# Altium project STAR_Prop_Reciever.PrjPcb
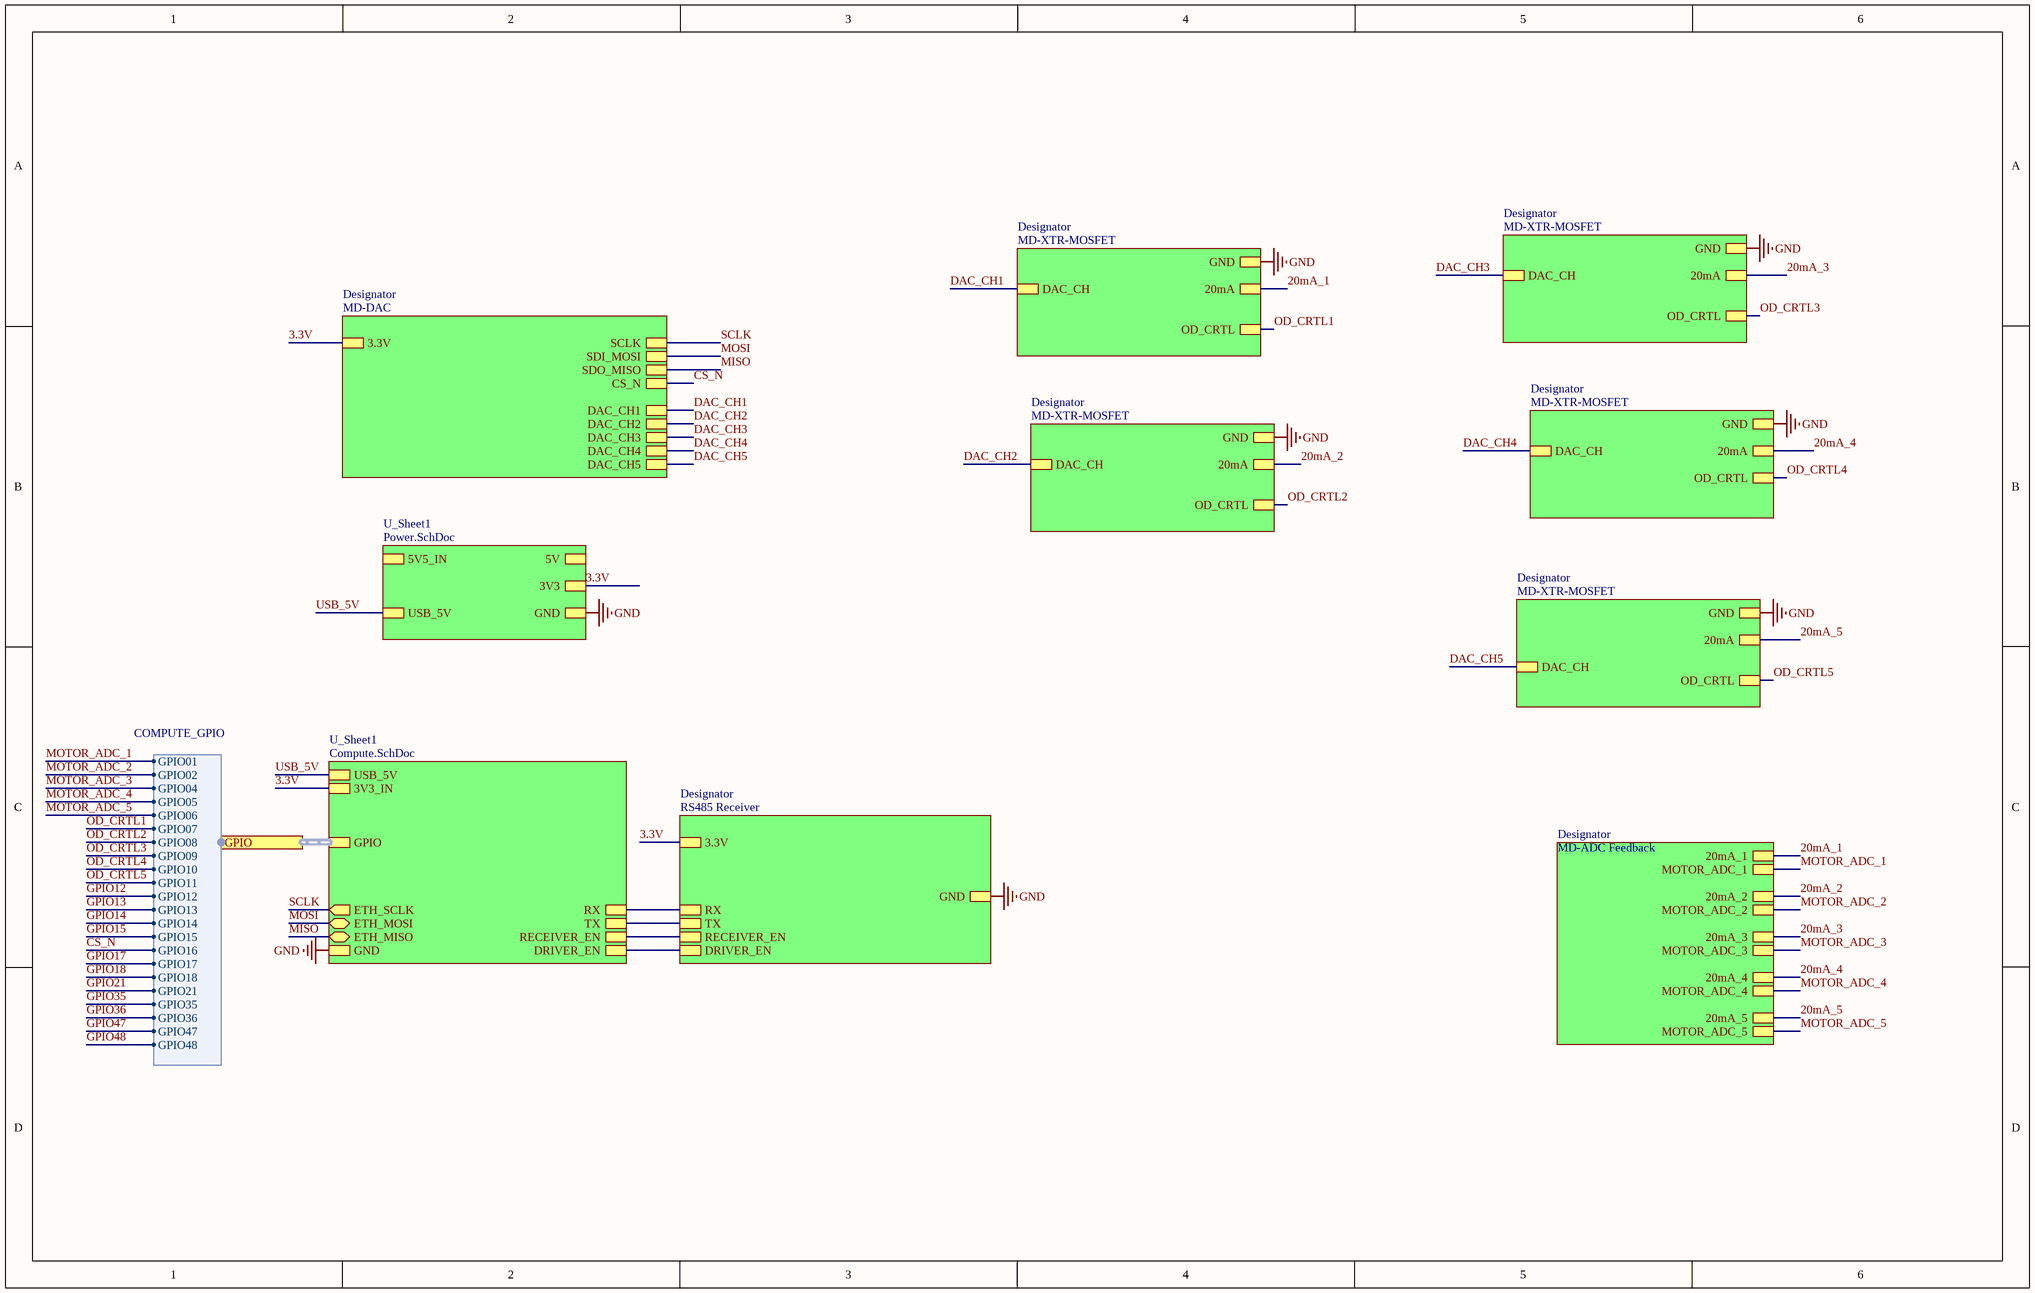
[diagram p0: Main.SchDoc]
7 sheets, 181 parts. Net scope: hierarchical (ports join the sheet entries above them; power ports are global).
Board file: PCB3.PcbDoc
Sheets:
  Main.SchDoc
    Designator = RS485 Receiver.SchDoc
    Designator = MD-DAC.SchDoc
    Designator = MD-XTR-MOSFET.SchDoc
    Designator = MD-ADC Feedback.SchDoc
    Designator = MD-XTR-MOSFET.SchDoc
    Designator = MD-XTR-MOSFET.SchDoc
    Designator = MD-XTR-MOSFET.SchDoc
    Designator = MD-XTR-MOSFET.SchDoc
    U_Sheet1 = Compute.SchDoc
    U_Sheet1 = Power.SchDoc

## Sheet Main.SchDoc
size B; SheetNumber: 1; SheetTotal: 7

### Sub-sheets
Designator = RS485 Receiver: 3.3V, GND, DRIVER_EN, RECEIVER_EN, TX, RX
Designator = MD-DAC: 3.3V, DAC_CH1, DAC_CH2, DAC_CH3, DAC_CH4, DAC_CH5, SCLK, SDI_MOSI, SDO_MISO, CS_N
Designator = MD-XTR-MOSFET: DAC_CH, OD_CRTL, GND, 20mA
Designator = MD-ADC Feedback: MOTOR_ADC_5, 20mA_5, MOTOR_ADC_4, 20mA_4, MOTOR_ADC_3, 20mA_3, MOTOR_ADC_2, 20mA_2, MOTOR_ADC_1, 20mA_1
Designator = MD-XTR-MOSFET: DAC_CH, OD_CRTL, GND, 20mA
Designator = MD-XTR-MOSFET: DAC_CH, OD_CRTL, GND, 20mA
Designator = MD-XTR-MOSFET: DAC_CH, OD_CRTL, 20mA, GND
Designator = MD-XTR-MOSFET: DAC_CH, OD_CRTL, 20mA, GND
U_Sheet1 = Compute.SchDoc: USB_5V, 3V3_IN, DRIVER_EN, RECEIVER_EN, TX, RX, GPIO (harness COMPUTE_GPIO), GND, ETH_MISO (bidir), ETH_MOSI (bidir), ETH_SCLK (out)
U_Sheet1 = Power.SchDoc: GND, 3V3, USB_5V, 5V5_IN, 5V

### Ports
GPIO (harness COMPUTE_GPIO)

### Harnesses
COMPUTE_GPIO: GPIO01, GPIO02, GPIO04, GPIO05, GPIO06, GPIO07, GPIO08, GPIO14, GPIO17, GPIO18, GPIO21, GPIO35, GPIO36, GPIO47, GPIO48, GPIO10, GPIO16, GPIO15, GPIO13, GPIO12, GPIO11, GPIO09

### Nets
3.3V: sheet Designator/3.3V, sheet Designator/3.3V, sheet U_Sheet1/3V3_IN, sheet U_Sheet1/3V3
GND: sheet Designator/GND, sheet Designator/GND, sheet Designator/GND, sheet Designator/GND, sheet Designator/GND, sheet Designator/GND, sheet U_Sheet1/GND, sheet U_Sheet1/GND
USB_5V: sheet U_Sheet1/USB_5V, sheet U_Sheet1/USB_5V
20mA_1: sheet Designator/RECEIVER_EN, sheet Designator/MOTOR_ADC_1, sheet Designator/20mA_1, sheet Designator/20mA, sheet U_Sheet1/RECEIVER_EN, port GPIO.GPIO01  [also labelled MOTOR_ADC_1]
20mA_2: sheet Designator/DRIVER_EN, sheet Designator/MOTOR_ADC_2, sheet Designator/20mA_2, sheet Designator/20mA, sheet U_Sheet1/DRIVER_EN, port GPIO.GPIO02  [also labelled MOTOR_ADC_2]
20mA_3: sheet Designator/MOTOR_ADC_3, sheet Designator/20mA_3, sheet Designator/20mA, port GPIO.GPIO04  [also labelled MOTOR_ADC_3]
20mA_4: sheet Designator/MOTOR_ADC_4, sheet Designator/20mA_4, sheet Designator/20mA, port GPIO.GPIO05  [also labelled MOTOR_ADC_4]
20mA_5: sheet Designator/20mA, sheet Designator/MOTOR_ADC_5, sheet Designator/20mA_5, port GPIO.GPIO06  [also labelled MOTOR_ADC_5]
CS_N: sheet Designator/CS_N, port GPIO.GPIO16
DAC_CH1: sheet Designator/DAC_CH1, sheet Designator/DAC_CH
DAC_CH2: sheet Designator/DAC_CH2, sheet Designator/DAC_CH
DAC_CH3: sheet Designator/DAC_CH3, sheet Designator/DAC_CH
DAC_CH4: sheet Designator/DAC_CH4, sheet Designator/DAC_CH
DAC_CH5: sheet Designator/DAC_CH5, sheet Designator/DAC_CH
GPIO12: port GPIO.GPIO12
GPIO13: port GPIO.GPIO13
GPIO14: port GPIO.GPIO14
GPIO15: port GPIO.GPIO15
GPIO17: port GPIO.GPIO17
GPIO18: port GPIO.GPIO18
GPIO21: port GPIO.GPIO21
GPIO35: port GPIO.GPIO35
GPIO36: port GPIO.GPIO36
GPIO47: port GPIO.GPIO47
GPIO48: port GPIO.GPIO48
MISO: sheet Designator/SDO_MISO, sheet U_Sheet1/ETH_MISO
MOSI: sheet Designator/SDI_MOSI, sheet U_Sheet1/ETH_MOSI
OD_CRTL1: sheet Designator/OD_CRTL, port GPIO.GPIO07  [project net GPIO07]
OD_CRTL2: sheet Designator/OD_CRTL, port GPIO.GPIO08  [project net GPIO08]
OD_CRTL3: sheet Designator/OD_CRTL, port GPIO.GPIO09  [project net GPIO09]
OD_CRTL4: sheet Designator/OD_CRTL, port GPIO.GPIO10  [project net GPIO10]
OD_CRTL5: sheet Designator/OD_CRTL, port GPIO.GPIO11  [project net GPIO11]
SCLK: sheet Designator/SCLK, sheet U_Sheet1/ETH_SCLK
NetCR1_1: sheet Designator/RX, sheet U_Sheet1/RX
NetCR1_4: sheet Designator/TX, sheet U_Sheet1/TX

### Buses and harness runs
harness port GPIO = sheet U_Sheet1/GPIO

## Sheet RS485 Receiver.SchDoc
size C; SheetNumber: 3; SheetTotal: 7
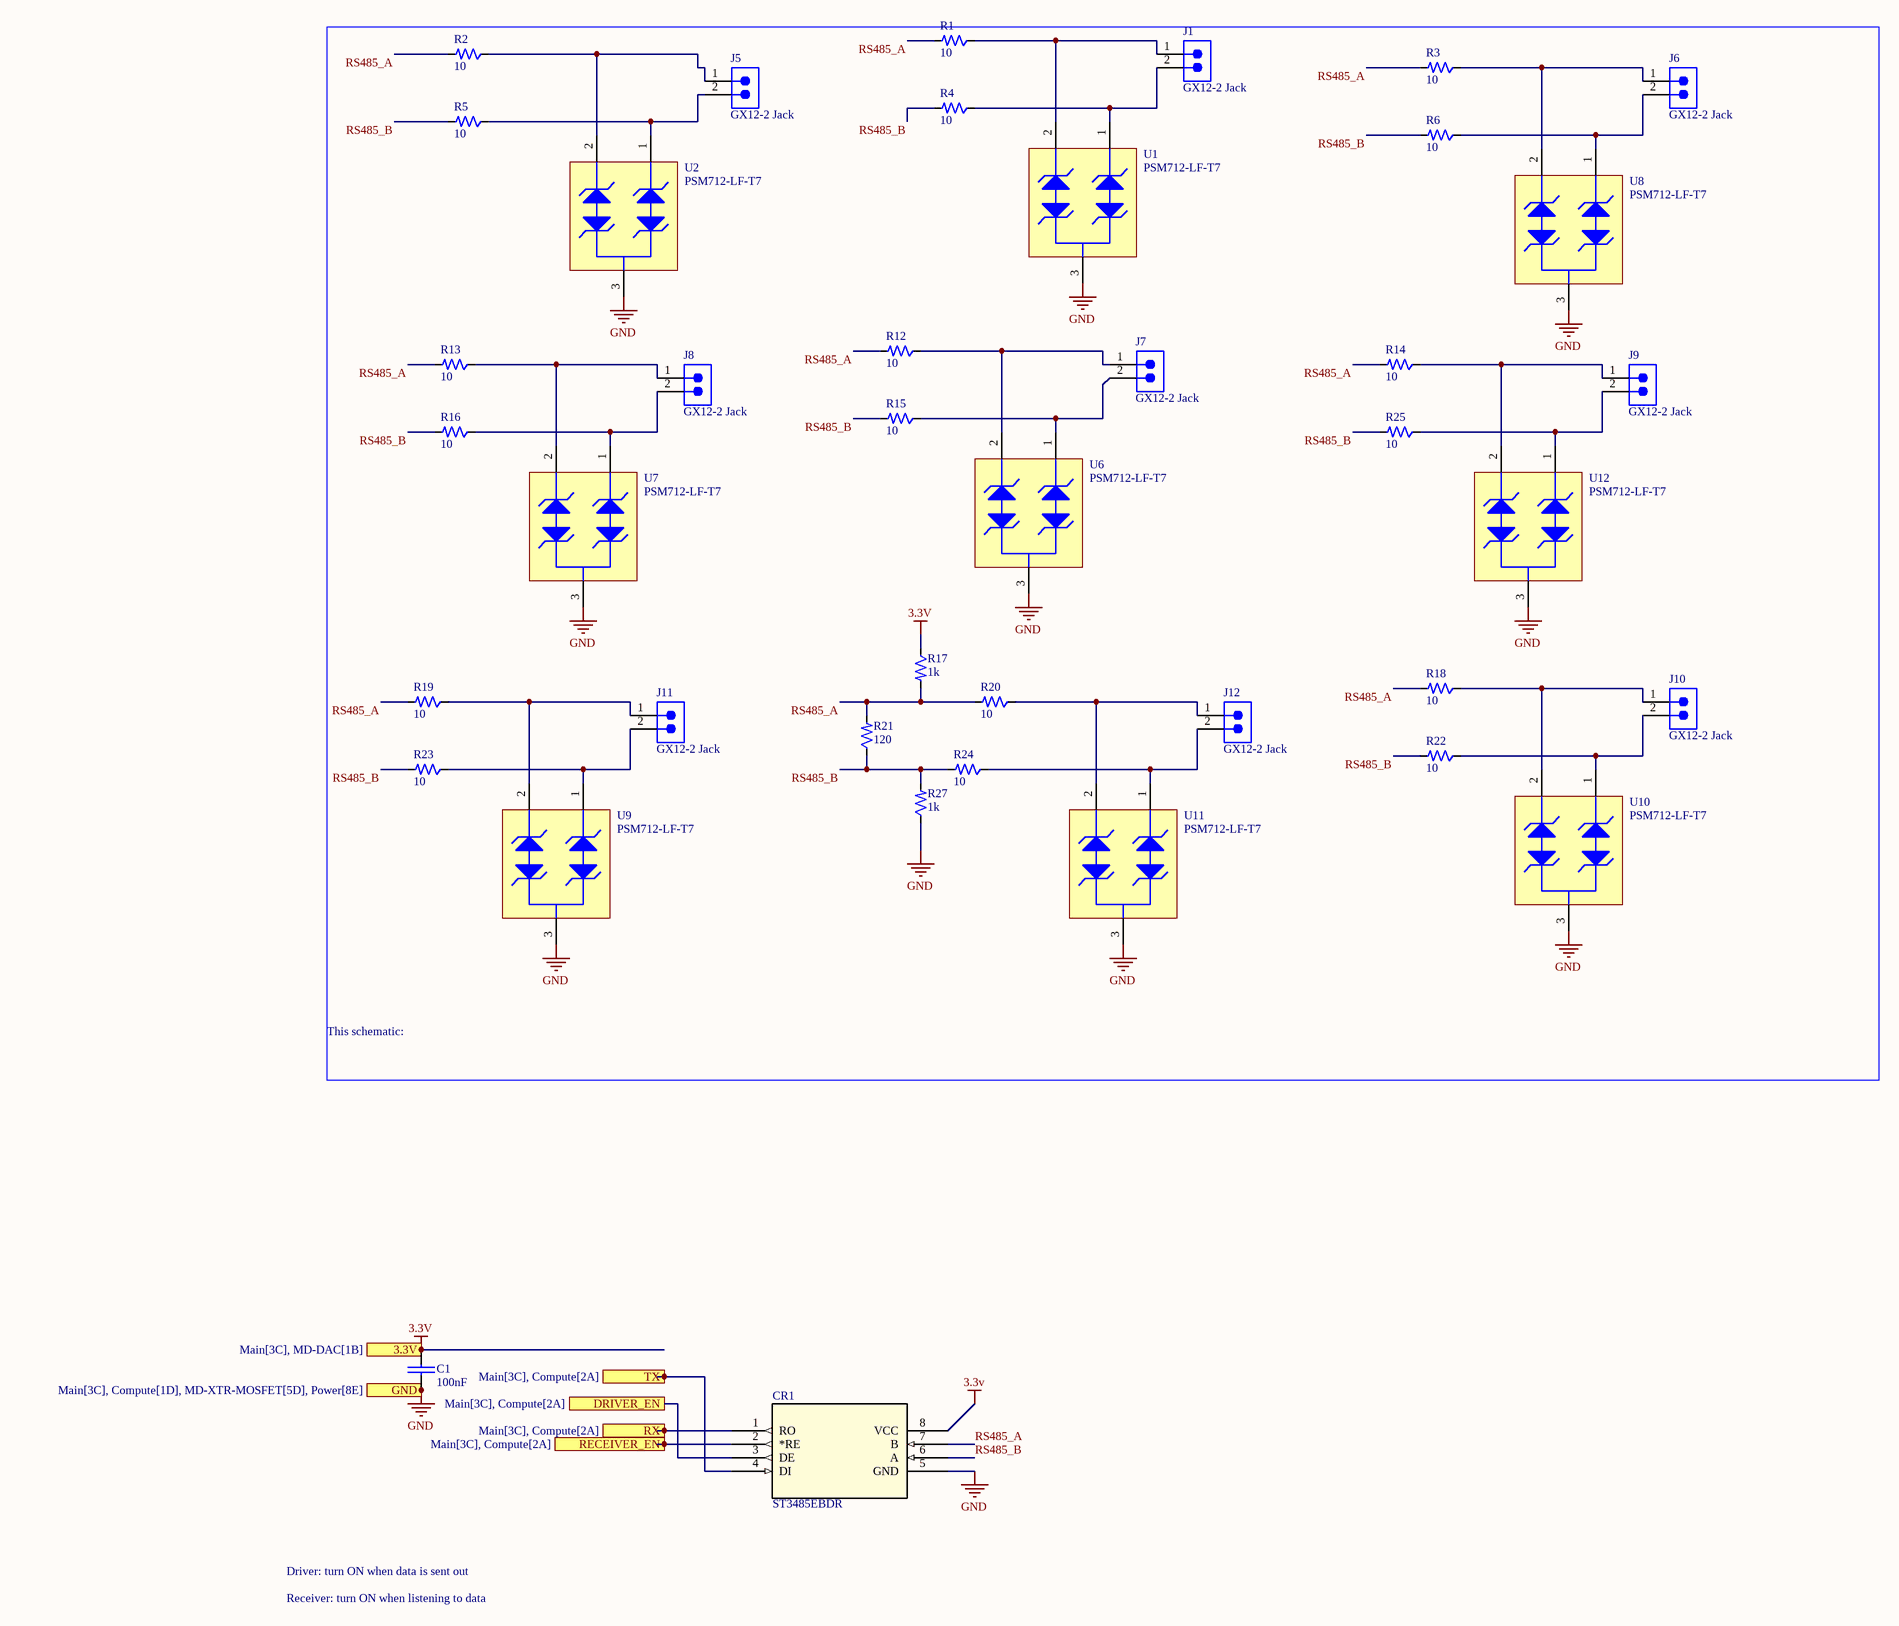
[diagram p1: RS485 Receiver.SchDoc]

### Parts
C1  value 100nF  [PCC-001-0015-1]  (hidden comment: Capacitor 220pF, 5%, 50V, C0G, 0805)
CR1  ST3485EBDR  [SO-8_STM]
J1  GX12-2 Jack  [PCC-001-0161-1]
J5  GX12-2 Jack  [PCC-001-0161-1]
J6  GX12-2 Jack  [PCC-001-0161-1]
J7  GX12-2 Jack  [PCC-001-0161-1]
J8  GX12-2 Jack  [PCC-001-0161-1]
J9  GX12-2 Jack  [PCC-001-0161-1]
J10  GX12-2 Jack  [PCC-001-0161-1]
J11  GX12-2 Jack  [PCC-001-0161-1]
J12  GX12-2 Jack  [PCC-001-0161-1]
R1  value 10  [PCC-001-0067-1]  (hidden comment: Resistor 750R, 0.1%, 1/8W, 0805)
R2  value 10  [PCC-001-0067-1]  (hidden comment: Resistor 750R, 0.1%, 1/8W, 0805)
R3  value 10  [PCC-001-0067-1]  (hidden comment: Resistor 750R, 0.1%, 1/8W, 0805)
R4  value 10  [PCC-001-0067-1]  (hidden comment: Resistor 750R, 0.1%, 1/8W, 0805)
R5  value 10  [PCC-001-0067-1]  (hidden comment: Resistor 750R, 0.1%, 1/8W, 0805)
R6  value 10  [PCC-001-0067-1]  (hidden comment: Resistor 750R, 0.1%, 1/8W, 0805)
R12  value 10  [PCC-001-0067-1]  (hidden comment: Resistor 750R, 0.1%, 1/8W, 0805)
R13  value 10  [PCC-001-0067-1]  (hidden comment: Resistor 750R, 0.1%, 1/8W, 0805)
R14  value 10  [PCC-001-0067-1]  (hidden comment: Resistor 750R, 0.1%, 1/8W, 0805)
R15  value 10  [PCC-001-0067-1]  (hidden comment: Resistor 750R, 0.1%, 1/8W, 0805)
R16  value 10  [PCC-001-0067-1]  (hidden comment: Resistor 750R, 0.1%, 1/8W, 0805)
R17  value 1k  [PCC-001-0067-1]  (hidden comment: Resistor 750R, 0.1%, 1/8W, 0805)
R18  value 10  [PCC-001-0067-1]  (hidden comment: Resistor 750R, 0.1%, 1/8W, 0805)
R19  value 10  [PCC-001-0067-1]  (hidden comment: Resistor 750R, 0.1%, 1/8W, 0805)
R20  value 10  [PCC-001-0067-1]  (hidden comment: Resistor 750R, 0.1%, 1/8W, 0805)
R21  value 120  [PCC-001-0067-1]  (hidden comment: Resistor 750R, 0.1%, 1/8W, 0805)
R22  value 10  [PCC-001-0067-1]  (hidden comment: Resistor 750R, 0.1%, 1/8W, 0805)
R23  value 10  [PCC-001-0067-1]  (hidden comment: Resistor 750R, 0.1%, 1/8W, 0805)
R24  value 10  [PCC-001-0067-1]  (hidden comment: Resistor 750R, 0.1%, 1/8W, 0805)
R25  value 10  [PCC-001-0067-1]  (hidden comment: Resistor 750R, 0.1%, 1/8W, 0805)
R27  value 1k  [PCC-001-0067-1]  (hidden comment: Resistor 750R, 0.1%, 1/8W, 0805)
U1  PSM712-LF-T7  [PRKT-SOT23-3_V]
U2  PSM712-LF-T7  [PRKT-SOT23-3_V]
U6  PSM712-LF-T7  [PRKT-SOT23-3_V]
U7  PSM712-LF-T7  [PRKT-SOT23-3_V]
U8  PSM712-LF-T7  [PRKT-SOT23-3_V]
U9  PSM712-LF-T7  [PRKT-SOT23-3_V]
U10  PSM712-LF-T7  [PRKT-SOT23-3_V]
U11  PSM712-LF-T7  [PRKT-SOT23-3_V]
U12  PSM712-LF-T7  [PRKT-SOT23-3_V]

### Blocks framed on the sheet
This schematic:: J1 J5-J12 R1-R6 R12-R25 R27 U1 U2 U6-U12

### Ports
3.3V (see Main[3C], MD-DAC[1B]), DRIVER_EN (see Main[3C], Compute[2A]), GND (see Main[3C], Compute[1D], MD-XTR-MOSFET[5D], Power[8E]), RECEIVER_EN (see Main[3C], Compute[2A]), RX (see Main[3C], Compute[2A]), TX (see Main[3C], Compute[2A])

### Nets
3.3V: C1.1 CR1.8(VCC) R17.2 ; port 3.3V
GND: C1.2 CR1.5(GND) R27.2 U1.3 U2.3 U6.3 U7.3 U8.3 U9.3 U10.3 U11.3 U12.3 ; port GND
20mA_1: CR1.2(*RE) ; port RECEIVER_EN
20mA_2: CR1.3(DE) ; port DRIVER_EN
RS485_A: CR1.7(B) R1.1 R2.1 R3.1 R12.1 R13.1 R14.1 R17.1 R18.1 R19.1 R20.1 R21.1
RS485_B: CR1.6(A) R4.1 R5.1 R6.1 R15.1 R16.1 R21.2 R22.1 R23.1 R24.1 R25.1 R27.1
NetCR1_1: CR1.1(RO) ; port RX
NetCR1_4: CR1.4(DI) ; port TX
NetJ1_1: J1.1 R1.2 U1.2
NetJ1_2: J1.2 R4.2 U1.1
NetJ5_1: J5.1 R2.2 U2.2
NetJ5_2: J5.2 R5.2 U2.1
NetJ6_1: J6.1 R3.2 U8.2
NetJ6_2: J6.2 R6.2 U8.1
NetJ7_1: J7.1 R12.2 U6.2
NetJ7_2: J7.2 R15.2 U6.1
NetJ8_1: J8.1 R13.2 U7.2
NetJ8_2: J8.2 R16.2 U7.1
NetJ9_1: J9.1 R14.2 U12.2
NetJ9_2: J9.2 R25.2 U12.1
NetJ10_1: J10.1 R18.2 U10.2
NetJ10_2: J10.2 R22.2 U10.1
NetJ11_1: J11.1 R19.2 U9.2
NetJ11_2: J11.2 R23.2 U9.1
NetJ12_1: J12.1 R20.2 U11.2
NetJ12_2: J12.2 R24.2 U11.1

### Notes on the sheet
- Driver: turn ON when data is sent out
- Receiver: turn ON when listening to data

### Library data of the parts
C1 = Capacitor 220pF, 5%, 50V, C0G, 0805-1: Capacitor, ceramic, 220pF, 5%, 50V, C0G, 0805; Manufacturer Part Number 1: CL21C221JBANNNC; Manufacturer 1: Samsung Electro-Mechanics; Supplier Part Number 1: 1276-1164-1-ND; Package: 0805; Tolerance: 5%; Voltage: 50V; Manufacturer 2: YAGEO; Supplier Part Number 2: C107112; Dielectric: C0G; Supplier 2: LCSC; Manufacturer Part Number 2: CC0805JRNPO9BN221; Supplier 1: DigiKey
CR1 = ST3485EBDR: 3.3 V Powered, 15 kV ESD protected, up to 12 Mbps RS-485/RS-422 transceiver, [-40oC, 85oC] temperature range; Manufacturer_Name: STMicroelectronics; Copyright: Copyright (C) 2025 Ultra Librarian. All rights reserved.; Manufacturer_Part_Number: ST3485EBDR; RefDes: RefDes; Type: Type
J1 J5-J12 = GX12-2 Jack-1: 2 pin GX12 aviation connector jack for throughhole soldering; Manufacturer 1: *; Manufacturer Part Number 2: *; Supplier Part Number 2: *; Supplier 1: DigiKey; Manufacturer 2: *; Manufacturer Part Number 1: *; Supplier Part Number 1: *; Supplier 2: LCSC
R1-R6 R12-R25 R27 = Resistor 750R, 0.1%, 1/8W, 0805-1: Resistor, 750R, 0.1%, 1/8W, 0805; Manufacturer Part Number 1: RT0805BRD07750RL; Manufacturer 1: YAGEO; Manufacturer 2: RESI; Supplier Part Number 1: YAG4940CT-ND; Manufacturer Part Number 2: PTFR0805B750RP9; Tolerance: 0.1%; Supplier Part Number 2: C2849336; Supplier 1: DigiKey; Power: 1/8W; Supplier 2: LCSC; Package: 0805
U1 U2 U6-U12 = CMP-2000-07553-1: TVS Array - Asymmetrical Data Line Protector, 600 W, 7.5 V, -55 to 150 degC, 3-Pin SOT23, RoHS, Tape and Reel; Manufacturer: Protek Devices; Min Breakdown Voltage: 7.5V; Direction: Bidirectional; Capacitance: 75pF; Current: 20uA; Power Dissipation: 600W; Working Voltage: 7V; Voltage: 12V; Case\/Package: SOT-23; Clamping Voltage: 17V; Element Configuration: Dual; Mounting Technology: SurfaceMount; RoHSCompliant: True; Radiation Hardening: No; Depth: 1.4mm; Lead Free: LeadFree; Package Description: 3-Pin Small Outline Transistor, Body 2.92 x 1.3 mm, Pitch 0.94 mm; Max Operating Temperature: 150degC; Length: 3.04mm; Manufacturer URL: http://www.protekdevices.com/; Min Operating Temperature: -55degC; Leakage Current: 20uA; Datasheet URL: www.protekdevices.com/xyz/documents/datasheets/psm712.pdf; Packaging: TapeandReel; Datasheet Version: 10/2013; Package Reference: SOT23-3; Number of Pins: 3

## Sheet MD-DAC.SchDoc
size A; SheetNumber: 6; SheetTotal: 8
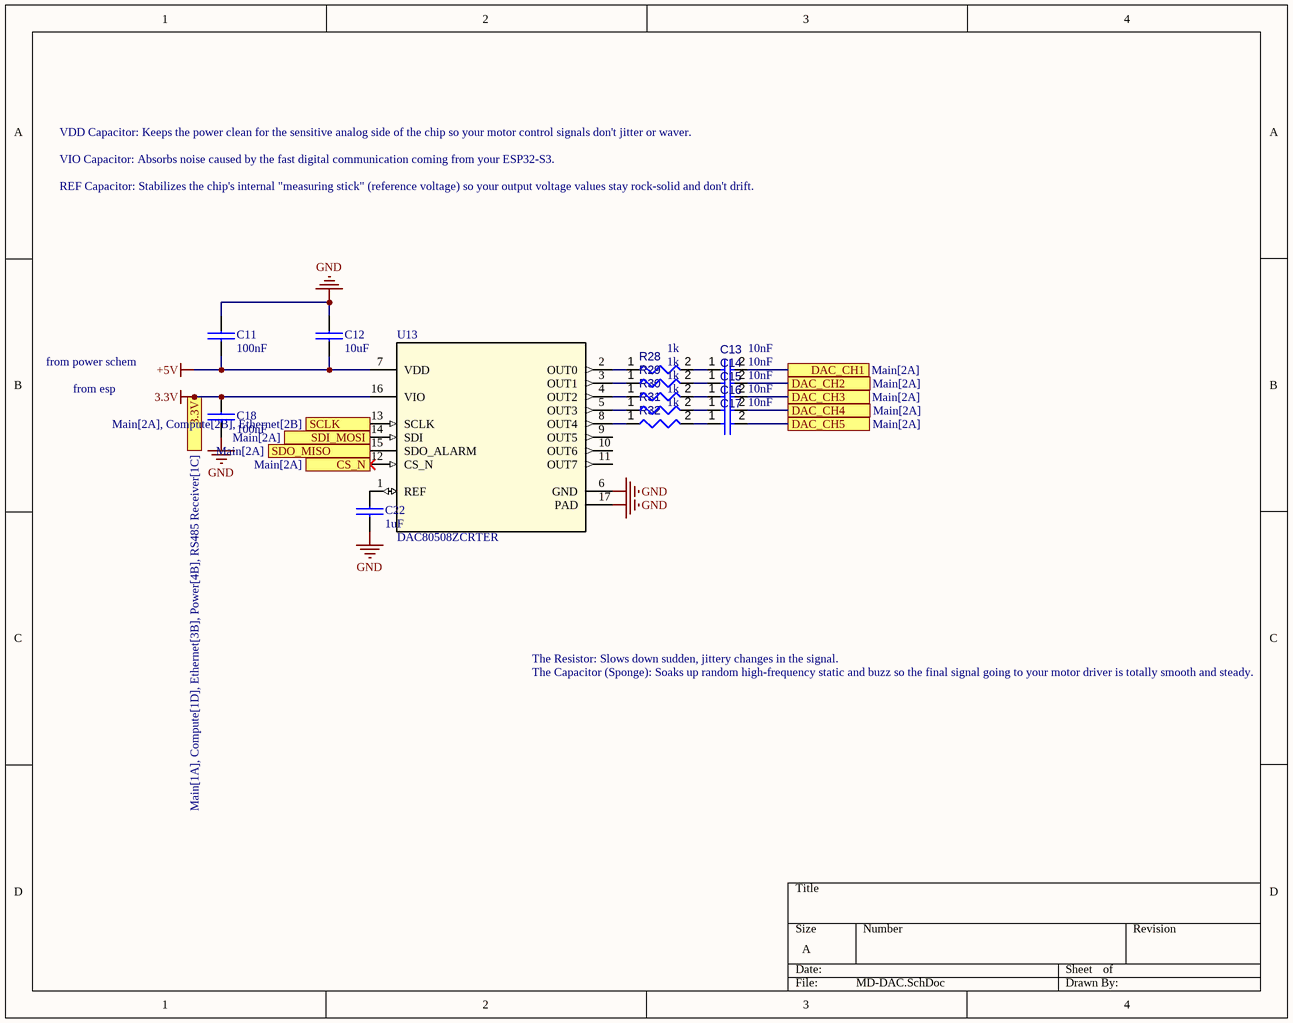
[diagram p2: MD-DAC.SchDoc]

### Parts
C11  value 100nF  [PCC-001-0015-1]  (hidden comment: Capacitor 15uF, 20%, 35V, X5R, 0805)
C12  value 10uF  [PCC-001-0015-1]  (hidden comment: Capacitor 15uF, 20%, 35V, X5R, 0805)
C13  value 10nF  [CAPC0402(1005)60_L]  (hidden comment: Capacitor 10nF +/-20% 50V 0402)
C14  value 10nF  [CAPC0402(1005)60_L]  (hidden comment: Capacitor 10nF +/-20% 50V 0402)
C15  value 10nF  [CAPC0402(1005)60_L]  (hidden comment: Capacitor 10nF +/-20% 50V 0402)
C16  value 10nF  [CAPC0402(1005)60_L]  (hidden comment: Capacitor 10nF +/-20% 50V 0402)
C17  value 10nF  [CAPC0402(1005)60_L]  (hidden comment: Capacitor 10nF +/-20% 50V 0402)
C18  value 100nF  [PCC-001-0015-1]  (hidden comment: Capacitor 15uF, 20%, 35V, X5R, 0805)
C22  value 1uF  [PCC-001-0015-1]  (hidden comment: Capacitor 15uF, 20%, 35V, X5R, 0805)
R28  value 1k  [RESC0402(1005)_L]  (hidden comment: Resistor 1K +/-5 % 0402 63 mW)
R29  value 1k  [RESC0402(1005)_L]  (hidden comment: Resistor 1K +/-5 % 0402 63 mW)
R30  value 1k  [RESC0402(1005)_L]  (hidden comment: Resistor 1K +/-5 % 0402 63 mW)
R31  value 1k  [RESC0402(1005)_L]  (hidden comment: Resistor 1K +/-5 % 0402 63 mW)
R32  value 1k  [RESC0402(1005)_L]  (hidden comment: Resistor 1K +/-5 % 0402 63 mW)
U13  DAC80508ZCRTER  [RTE0016D]

### Ports
3.3V (see Main[1A], Compute[1D], Ethernet[3B], Power[4B], RS485 Receiver[1C]), CS_N (see Main[2A]), DAC_CH1 (see Main[2A]), DAC_CH2 (see Main[2A]), DAC_CH3 (see Main[2A]), DAC_CH4 (see Main[2A]), DAC_CH5 (see Main[2A]), SCLK (see Main[2A], Compute[2B], Ethernet[2B]), SDI_MOSI (see Main[2A]), SDO_MISO (see Main[2A])

### Nets
3.3V: C18.1 U13.16(VIO) ; port 3.3V
+5V: C11.2 C12.2 U13.7(VDD)
GND: C11.1 C12.1 C18.2 C22.2 U13.6(GND) U13.17(PAD)
CS_N: U13.12(CS_N) ; port CS_N
DAC_CH1: C13.2 ; port DAC_CH1
DAC_CH2: C14.2 ; port DAC_CH2
DAC_CH3: C15.2 ; port DAC_CH3
DAC_CH4: C16.2 ; port DAC_CH4
DAC_CH5: C17.2 ; port DAC_CH5
MISO: U13.15(SDO_ALARM) ; port SDO_MISO
MOSI: U13.14(SDI) ; port SDI_MOSI
SCLK: U13.13(SCLK) ; port SCLK
NetC13_1: C13.1 R28.2
NetC14_1: C14.1 R29.2
NetC15_1: C15.1 R30.2
NetC16_1: C16.1 R31.2
NetC17_1: C17.1 R32.2
NetC22_1: C22.1 U13.1(REF)
NetR28_1: R28.1 U13.2(OUT0)
NetR29_1: R29.1 U13.3(OUT1)
NetR30_1: R30.1 U13.4(OUT2)
NetR31_1: R31.1 U13.5(OUT3)
NetR32_1: R32.1 U13.8(OUT4)

Not connected (* = marked no-connect by the designer): U13 9(OUT5) 10(OUT6) 11(OUT7)

### Notes on the sheet
- VDD Capacitor: Keeps the power clean for the sensitive analog side of the chip so your motor control signals don't jitter or waver.
- VIO Capacitor: Absorbs noise caused by the fast digital communication coming from your ESP32-S3.
- REF Capacitor: Stabilizes the chip's internal "measuring stick" (reference voltage) so your output voltage values stay rock-solid and don't drift.
- from power schem
- from esp
- The Resistor: Slows down sudden, jittery changes in the signal.
- The Capacitor (Sponge): Soaks up random high-frequency static and buzz so the final signal going to your motor driver is totally smooth and steady.

### Library data of the parts
C11 C12 C18 C22 = Capacitor 15uF, 20%, 35V, X5R, 0805-1: Capacitor, ceramic, 15uF, 20%, 35V, X5R, 0805; Manufacturer Part Number 1: GMC21X5R156M35NT; Manufacturer 1: Cal-Chip Electronics; Manufacturer 2: TDK; Supplier 2: LCSC; Package: 0805; Manufacturer Part Number 2: C2012X5R1V156MT000E; Supplier Part Number 2: C5367448; Tolerance: 20%; Supplier Part Number 1: 4713-GMC21X5R156M35NTCT-ND; Voltage: 35V; Supplier 1: DigiKey; Dielectric: X5R
C13-C17 = CMP-001-00069-3: Chip Capacitor, 10nF +/-20%, 50V, 0402, Thickness 0.6 mm; Tolerance: 5%; Max Operating Temperature: 85°C; Pins: 2; Case/Package: 0402; Voltage Rating: 50V; Min Operating Temperature: -55°C; Mounting Technology: SMT
R28-R32 = CMP-009-00157-3: Chip Resistor, 1 kOhms, +/-5 %, 63 mW, -55 to 155 degC, 0402; Tolerance: 5%; Power: 63mW; Case/Package: 0402; Pins: 2; Min Operating Temperature: -55°C; Max Operating Temperature: 155°C
U13 = CMP-033-000003-1: True 16-bit, 8-channel, SPI, voltage-output DAC with precision internal reference 16-WQFN -40 to 125; Manufacturer_Name: Texas Instruments; RefDes: RefDes; Copyright: Copyright (C) 2026 Ultra Librarian. All rights reserved.; TYPE: TYPE; Datasheet: https://www.ti.com/lit/gpn/dac80508; Design Item ID: DAC80508ZCRTER; Manufacturer_Part_Number: DAC80508ZCRTER; Source: DAC80508ZCRTER.SchLib

## Sheet MD-XTR-MOSFET.SchDoc
size 431 x 279 mm; SheetNumber: 6; SheetTotal: 7
Used 5 times, as channels Designator, Designator, Designator, Designator, Designator. Parts and nets are listed once, with the designators drawn on the sheet.
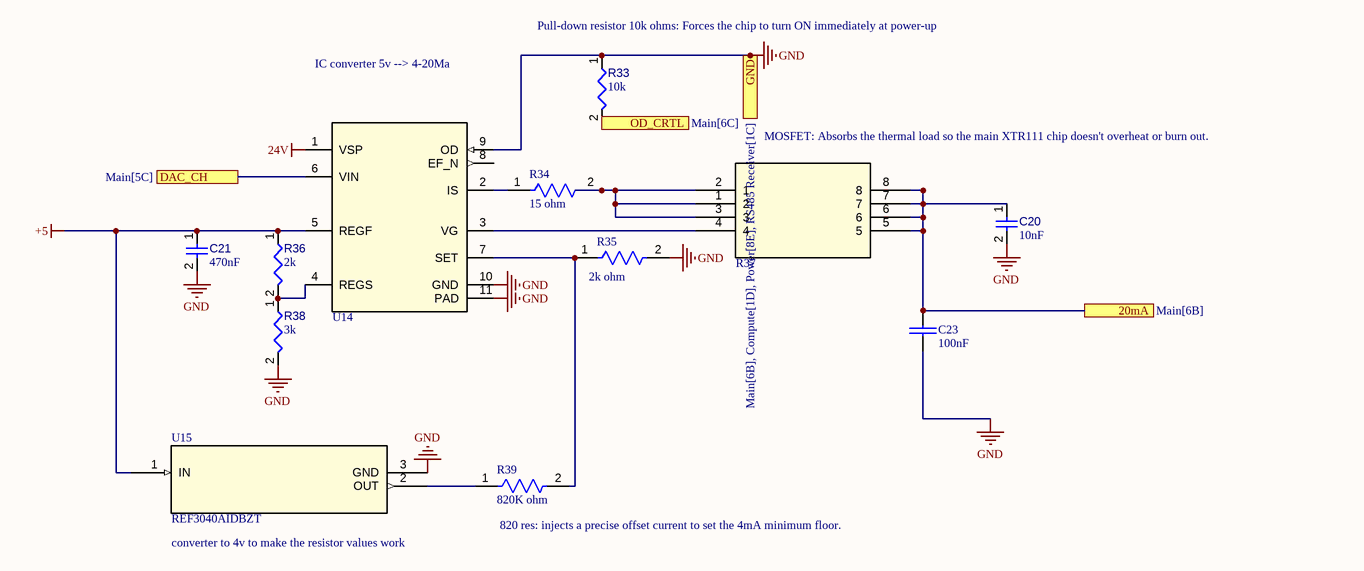
[diagram p3: MD-XTR-MOSFET.SchDoc]

### Parts
C20  value 10nF  [CAPC0402(1005)60_L]  (hidden comment: Capacitor 10nF +/-20% 50V 0402)
C21  value 470nF  [CAPC0402(1005)60_L]  (hidden comment: Capacitor 470nF +/-40% 10V 0402)
C23  value 100nF  [PCC-001-0015-1]  (hidden comment: Capacitor 15uF, 20%, 35V, X5R, 0805)
R33  value 10k  [RESC0402(1005)_L]  (hidden comment: 10KR2F)
R34  15 ohm  [FP-AF0603-IPC_C]
R35  2k ohm  [FP-RN73R1E-IPC_B]
R36  value 2k  [RESC0402(1005)_L]  (hidden comment: Resistor 2K +/-5 % 0402 63 mW)
R37  RRH100P03GZETB  [TRANS_RRH040P_ROM]  (value not drawn)
R38  value 3k  [RESC0402(1005)_L]  (hidden comment: Resistor 3K +/-1 % 0402 63 mW)
R39  820K ohm  [FP-CRGP0402-IPC_C]
U14  XTR111AIDRCR  [DRC0010A]  (value not drawn)
U15  REF3040AIDBZT  [DBZ3]

### Ports
20mA (see Main[6B]), DAC_CH (see Main[5C]), GND (see Main[6B], Compute[1D], Power[8E], RS485 Receiver[1C]), OD_CRTL (see Main[6C])

### Nets
24V: U14.1(VSP)
+5: C21.1 R36.1 U14.5(REGF) U15.1(IN)
GND: C20.2 C21.2 C23.2 R33.1 R35.2 R38.2 U14.9(OD) U14.10(GND) U14.11(PAD) U15.3(GND) ; port GND
20mA: C20.1 C23.1 R37.5 R37.6 R37.7 R37.8 ; port 20mA
DAC_CH: U14.6(VIN) ; port DAC_CH
OD_CRTL: R33.2 ; port OD_CRTL
NetR34_1: R34.1 U14.2(IS)
NetR34_2: R34.2 R37.1(2) R37.2(1) R37.3
NetR35_1: R35.1 R39.2 U14.7(SET)
NetR36_2: R36.2 R38.1 U14.4(REGS)
NetR37_4: R37.4 U14.3(VG)
NetR39_1: R39.1 U15.2(OUT)

Not connected (* = marked no-connect by the designer): U14 8(EF_N)

### Channels
Designator: designators end in E; ports 20mA=20mA_5 DAC_CH=DAC_CH5 GND=GND OD_CRTL=GPIO11
Designator: designators end in D; ports 20mA=20mA_1 DAC_CH=DAC_CH1 GND=GND OD_CRTL=GPIO07
Designator: designators end in C; ports 20mA=20mA_2 DAC_CH=DAC_CH2 GND=GND OD_CRTL=GPIO08
Designator: designators end in B; ports 20mA=20mA_3 DAC_CH=DAC_CH3 GND=GND OD_CRTL=GPIO09
Designator: designators end in A; ports 20mA=20mA_4 DAC_CH=DAC_CH4 GND=GND OD_CRTL=GPIO10

### Notes on the sheet
- (near R33) Pull-down resistor 10k ohms: Forces the chip to turn ON immediately at power-up
- IC converter 5v --> 4-20Ma
- MOSFET: Absorbs the thermal load so the main XTR111 chip doesn't overheat or burn out.
- converter to 4v to make the resistor values work
- (near R39) 820 res: injects a precise offset current to set the 4mA minimum floor.
- DWG. NO.
- REV.
- SHT.
- THIS DOCUMENT AND THE DATA DISCLOSED HEREIN OR HEREWITH IS THE PROPERTY OF ALTIUM LIMITED AND MAY BE FREELY DISTRIBUTED IN WHOLE. NO RIGHTS ARE RESERVED OR EXPRESS OR IMPLIED WARANTEE GIVEN.
- REVISION
- DESCRIPTION
- DATE
- APPROVED
- ENG:
- APPROVALS
- PROJECT
- DSN:
- CHK:
- REFERENCE DOCUMENTS
- PROJECT REVISION:
- TITLE
- DOCUMENT REVISION:
- DESIGN ITEM:
- BOM:
- FAB DWG:
- PCB DWG:
- ASSY DWG:
- SCALE:
- SIZE
- B
- CAGE CODE
- FILE NAME
- DWG NO.
- SHEET
- OF
- REV

### Library data of the parts
C20 = CMP-001-00069-3: as C13 on sheet MD-DAC; Max Operating Temperature: 85°C; Pins: 2; Case/Package: 0402; Voltage Rating: 50V; Min Operating Temperature: -55°C; Mounting Technology: SMT
C21 = CMP-001-00060-4: Chip Capacitor, 470nF +/-40%, 10V, 0402, Thickness 0.6 mm; Tolerance: 20%; Max Operating Temperature: 85°C; Case/Package: 0402; Voltage Rating: 10V; Min Operating Temperature: -55°C; Mounting Technology: SMT; Pins: 2
C23 = Capacitor 15uF, 20%, 35V, X5R, 0805-1: as C11 on sheet MD-DAC; Manufacturer 2: TDK; Supplier 2: LCSC; Package: 0805; Manufacturer Part Number 2: C2012X5R1V156MT000E; Supplier Part Number 2: C5367448; Tolerance: 20%; Supplier Part Number 1: 4713-GMC21X5R156M35NTCT-ND; Voltage: 35V; Supplier 1: DigiKey; Dielectric: X5R
R33 = CMP-009-00066-2: 10K 0.063W 1% 0402 (1005 Metric)  SMD; Power: 63mW; Case/Package: 0402; Mounting Technology: SMT; Pins: 2; Tolerance: 1%
R34 = CMP-03412-045241-1: Anti-Sulfurated Chip Resistors Automotive Grade 15Ω 1% 100ppm/°C 0603; Resistance: 15R; Max Power Dissipation: 100mW; Height: 0.022inch; Width: 0.031inch; Tolerance: 1%; Resistor Type: Thick Film; Features: Moisture Resistant; RoHS Compliant: Yes; Length: 0.063inch; Min Operating Temperature: -55°C; Number of Terminations: 2; Temperature Coefficient: 100ppm/°C; Packaging: Tape and Reel; Case/Package: 0603; Series: AF; Max Operating Temperature: 155°C
R35 = CMP-04015-046600-1: 2kΩ ±1% 0.063W, 1/16W Chip Resistor 0402 (1005 Metric) Moisture Resistant Thin Film
R36 = CMP-009-00138-3: Chip Resistor, 2 kOhms, +/-5 %, 63 mW, -55 to 155 degC, 0402; Tolerance: 5%; Power: 63mW; Max Operating Temperature: 155°C; Pins: 2; Min Operating Temperature: -55°C; Case/Package: 0402
R37 = CMP-009-00252-1: No Description Available; Manufacturer_Name: ROHM Semiconductor; RefDes: RefDes; Type: Type; Copyright: Copyright (C) 2026 Ultra Librarian. All rights reserved.; Source: RRH100P03GZETB.SchLib; Manufacturer_Part_Number: RRH100P03GZETB; Design Item ID: RRH100P03GZETB
R38 = CMP-009-00145-3: Chip Resistor, 3 kOhms, +/-1 %, 63 mW, -55 to 155 degC, 0402; Tolerance: 1%; Power: 63mW; Case/Package: 0402; Min Operating Temperature: -55°C; Max Operating Temperature: 155°C; Pins: 2
R39 = CMP-03211-002910-1: CRGP0402 820KΩ 0.125W ±100ppm/°C 1% 50V; Manufacturer: TE; Manufacturer Part Number: CRGP0402F820K; Tolerance: 0.01; Ipc Land Pattern Name: RESC11050X35; Composition: Thick Film; RoHS: TRUE; Temperature Range Low: -55°C; Temperature Coefficient: ±100ppm/°C; ComponentLink2URL: https://www.mouser.ca/datasheet/2/418/NG_DS_9-1773463-9_A-1358566.pdf; Value: 820KΩ; Series: CRGP; Lead Free: Yes; Voltage Rating: 50V; Power Rating: 0.125W; Resistance: 820KΩ; Automotive: No; Temperature Range High: +155°C; Package: CRGP0402; Device Class L1: Passive Components; Octopart: https://octopart.com/crgp0402f820k-te+connectivity-91018714; Temperature: -55°C to +155°C; Device Class L2: Resistors; Device Class L3: Chip SMD Resistors; Category: Res; ComponentLink2Description: Datasheet; Height: 0.4mm
U14 = CMP-009-00251-1: Voltage-to-current converter/transmitter with 3-V to 15-V regulator and resistor set I/O ratio 10-VSON -40 to 125; PartNumber: XTR111AIDRCT; Manufacturer_Name: Texas Instruments; CompType: IC; Copyright: Copyright (C) 2025 Ultra Librarian. All rights reserved.; MountType: SMT; RoHS: Y; Source: XTR111AIDRCR.SchLib; Design Item ID: XTR111AIDRCR; Application_BuildNumber: *; Manufacturer: Texas Instruments; Case/Package: DRC0010A; RefDes: RefDes; TYPE: TYPE; Manufacturer_Part_Number: XTR111AIDRCR
U15 = CMP-256-000000-1: 50ppm/Â°C drift, 50ÂµA Iq in SOT-23-3 package series voltage reference 3-SOT-23 -40 to 125; Manufacturer_Name: Texas Instruments; Type: Type; Manufacturer_Part_Number: REF3040AIDBZT; Source: REF3040AIDBZT.SchLib; Copyright: Copyright (C) 2025 Ultra Librarian. All rights reserved.; Design Item ID: REF3040AIDBZT; RefDes: RefDes

## Sheet MD-ADC Feedback.SchDoc
size A; SheetNumber: 8; SheetTotal: 8
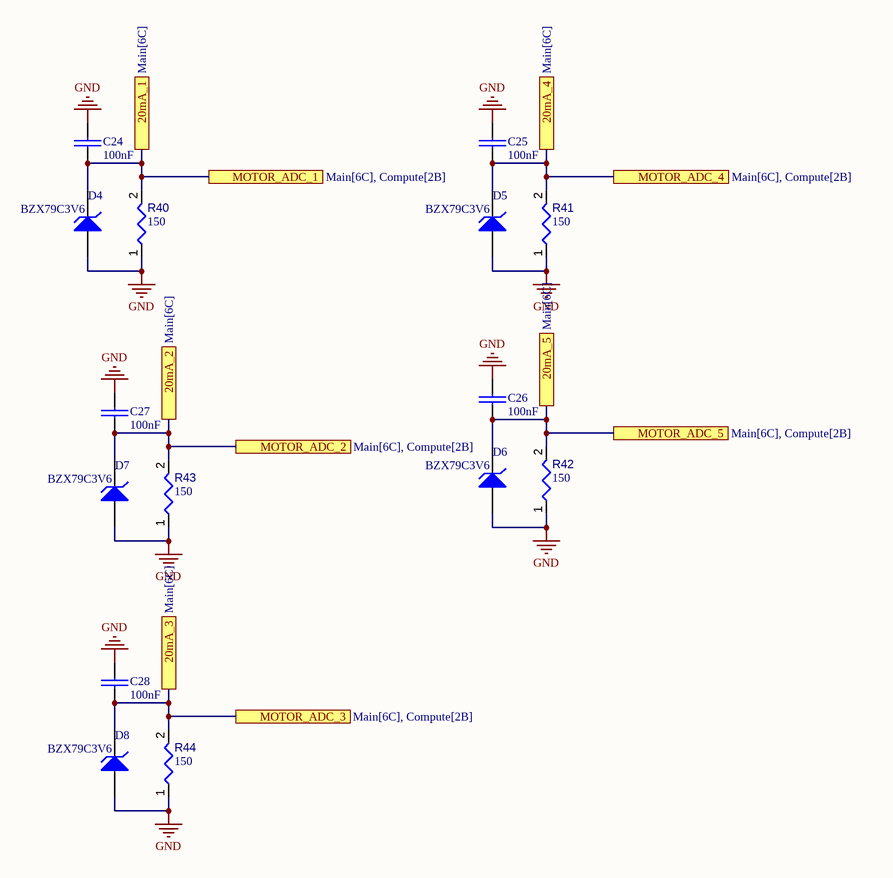
[diagram p4: MD-ADC Feedback.SchDoc]

### Parts
C24  value 100nF  [PCC-001-0014-1]  (hidden comment: Capacitor 82pF, 5%, 50V, C0G, 0603)
C25  value 100nF  [PCC-001-0014-1]  (hidden comment: Capacitor 82pF, 5%, 50V, C0G, 0603)
C26  value 100nF  [PCC-001-0014-1]  (hidden comment: Capacitor 82pF, 5%, 50V, C0G, 0603)
C27  value 100nF  [PCC-001-0014-1]  (hidden comment: Capacitor 82pF, 5%, 50V, C0G, 0603)
C28  value 100nF  [PCC-001-0014-1]  (hidden comment: Capacitor 82pF, 5%, 50V, C0G, 0603)
D4  BZX79C3V6  [FAIR-DO-35-2]
D5  BZX79C3V6  [FAIR-DO-35-2]
D6  BZX79C3V6  [FAIR-DO-35-2]
D7  BZX79C3V6  [FAIR-DO-35-2]
D8  BZX79C3V6  [FAIR-DO-35-2]
R40  value 150  [RESC0402(1005)_L]  (hidden comment: 316KR2F)
R41  value 150  [RESC0402(1005)_L]  (hidden comment: 316KR2F)
R42  value 150  [RESC0402(1005)_L]  (hidden comment: 316KR2F)
R43  value 150  [RESC0402(1005)_L]  (hidden comment: 316KR2F)
R44  value 150  [RESC0402(1005)_L]  (hidden comment: 316KR2F)

### Ports
20mA_1 (see Main[6C]), 20mA_2 (see Main[6C]), 20mA_3 (see Main[6C]), 20mA_4 (see Main[6C]), 20mA_5 (see Main[6C]), MOTOR_ADC_1 (see Main[6C], Compute[2B]), MOTOR_ADC_2 (see Main[6C], Compute[2B]), MOTOR_ADC_3 (see Main[6C], Compute[2B]), MOTOR_ADC_4 (see Main[6C], Compute[2B]), MOTOR_ADC_5 (see Main[6C], Compute[2B])

### Nets
GND: C24.1 C25.1 C26.1 C27.1 C28.1 D4.1(A) D5.1(A) D6.1(A) D7.1(A) D8.1(A) R40.1 R41.1 R42.1 R43.1 R44.1
20mA_1: C24.2 D4.2(K) R40.2 ; port 20mA_1, port MOTOR_ADC_1
20mA_2: C27.2 D7.2(K) R43.2 ; port 20mA_2, port MOTOR_ADC_2
20mA_3: C28.2 D8.2(K) R44.2 ; port 20mA_3, port MOTOR_ADC_3
20mA_4: C25.2 D5.2(K) R41.2 ; port 20mA_4, port MOTOR_ADC_4
20mA_5: C26.2 D6.2(K) R42.2 ; port 20mA_5, port MOTOR_ADC_5

### Library data of the parts
C24-C28 = Capacitor 82pF, 5%, 50V, C0G, 0603-1: Capacitor, ceramic, 82pF, 5%, 50V, C0G, 0603; Manufacturer 1: Samsung Electro-Mechanics; Manufacturer Part Number 1: CL10C820JB81PND; Supplier Part Number 1: 1276-CL10C820JB81PNDCT-ND; Supplier Part Number 2: C1683; Manufacturer 2: FH; Dielectric: C0G; Voltage: 50V; Manufacturer Part Number 2: 0603CG820J500NT; Supplier 1: DigiKey; Package: 0603; Tolerance: 5%; Supplier 2: LCSC
D4-D8 = CMP-004-00021-2: Zener Diode, 3.6 V, 5 mA, -65 to 200 degC, 2-Pin DO-35, RoHS, Bulk; Manufacturer: Fairchild Semiconductor; Tolerance: 6%; Power: 500mW; Forward Voltage: 1.5V; Impedance: 90Ohm; Package Quantity: 1000; Min Operating Temperature: -65°C; Datasheet Version: Rev. C1, 07/2007; Max Operating Temperature: 200°C; Mounting Technology: TH; Package Description: 2-Pin Through Hole Diode, Dia 1.72 mm, Body Length 3.805 mm; RoHS Compliant: True; Manufacturer URL: https://www.fairchildsemi.com/; Package Reference: DO-35-2; Case/Package: DO-35-2; Datasheet URL: https://www.fairchildsemi.com/datasheets/BZ/BZX79C3V6.pdf; Package URL: https://www.fairchildsemi.com/package-drawings/DO/DO35A.pdf; Pins: 2; Packaging: Bulk
R40-R44 = CMP-009-00093-2: 316K 0.063W 1% 0402 (1005 Metric)  SMD; Power: 63mW; Tolerance: 1%; Mounting Technology: SMT; Pins: 2; Case/Package: 0402

## Sheet Compute.SchDoc
size A; SheetNumber: 2; SheetTotal: 7
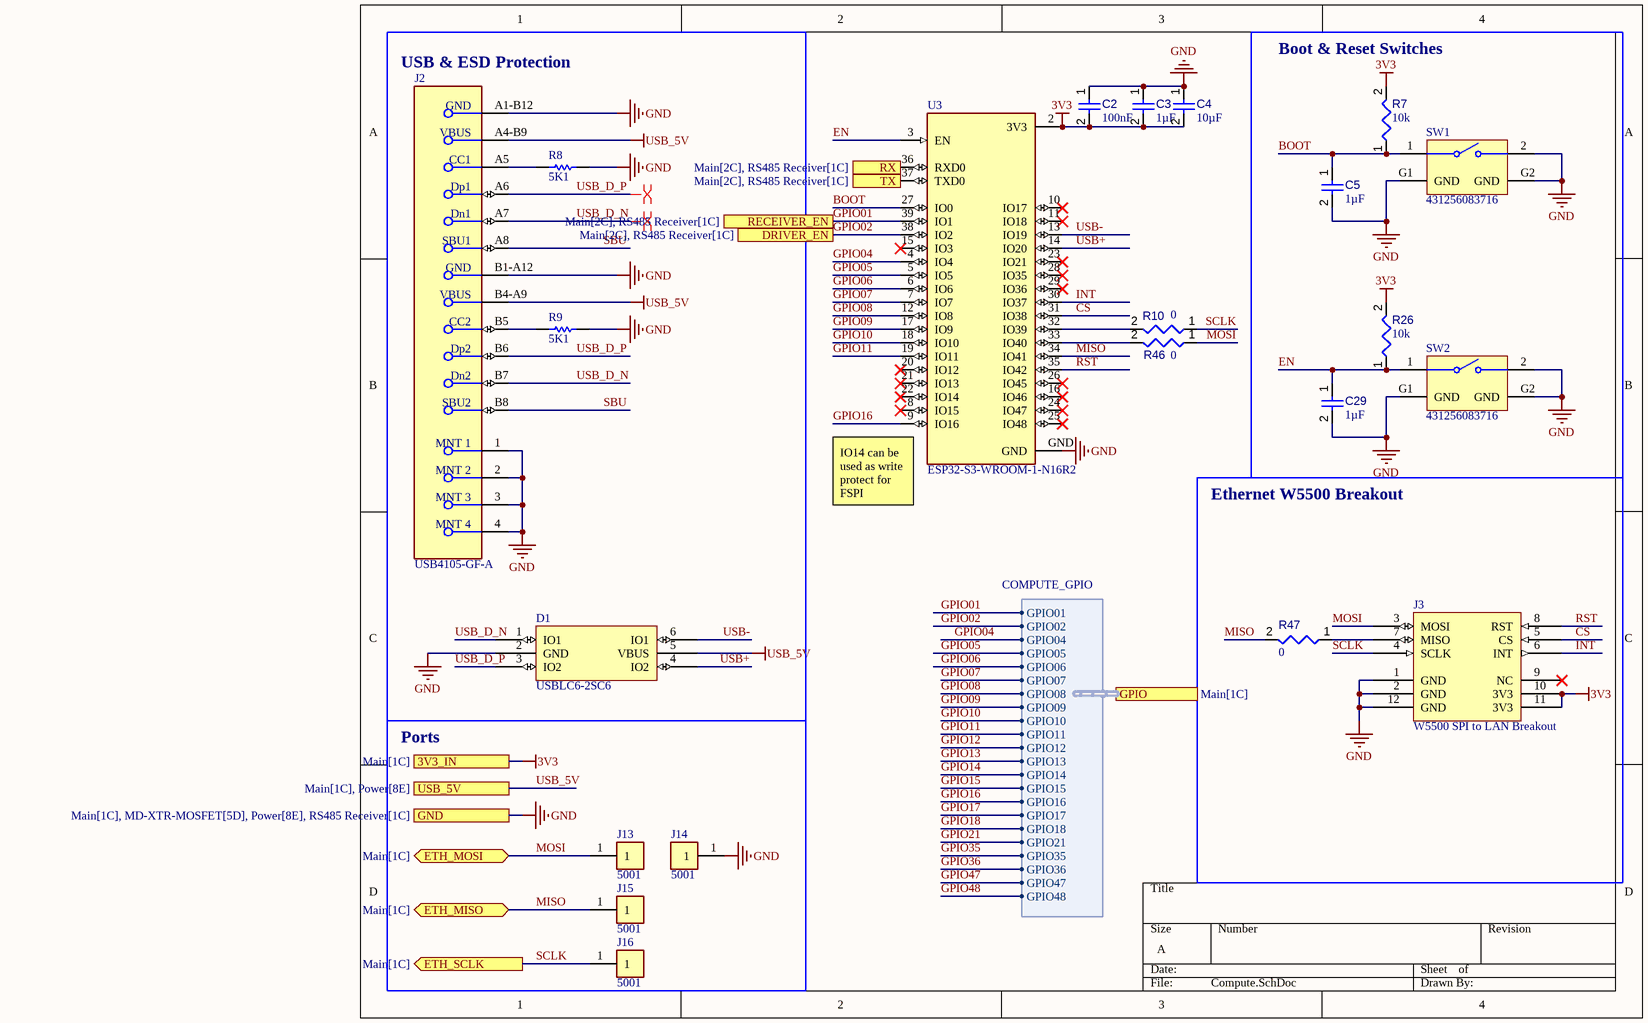
[diagram p5: Compute.SchDoc]

### Parts
C2  value 100nF  [CAPC1608X90X40NL10T20]  (hidden comment: Capacitor 100 nF +/-10% 50 V 0603)
C3  value 1µF  [CAPC1608X90X40LL10T20]  (hidden comment: Capacitor 1 uF +/- 10% 25 V 0603)
C4  value 10µF  [CAPC0603(1608)100_L]  (hidden comment: Capacitor 10µF +/-20% 10V 0603)
C5  value 1µF  [CAPC1608X90X40LL10T20]  (hidden comment: Capacitor 1 uF +/- 10% 25 V 0603)
C29  value 1µF  [CAPC1608X90X40LL10T20]  (hidden comment: Capacitor 1 uF +/- 10% 25 V 0603)
D1  USBLC6-2SC6  [STM-SOT23-6L_V]
J2  USB4105-GF-A  [FP-USB4105-GF-A-MFG]
J3  W5500 SPI to LAN Breakout  [W5500 SPI to LAN Breakout-Footprint-1]
J13  5001  [FP-5001-MFG]
J14  5001  [FP-5001-MFG]
J15  5001  [FP-5001-MFG]
J16  5001  [FP-5001-MFG]
R7  value 10k  [RESC1608X55X25ML10T15]  (hidden comment: Resistor 10k +/-1% 0603 100 mW)
R8  value 5K1  [RESC0603(1608)_L]  (hidden comment: Resistor 5.1k +/-1% 0603 100 mW)
R9  value 5K1  [RESC0603(1608)_L]  (hidden comment: Resistor 5.1k +/-1% 0603 100 mW)
R10  value 0  [RESC0603(1608)_L]  (hidden comment: 0R3J)
R26  value 10k  [RESC1608X55X25ML10T15]  (hidden comment: Resistor 10k +/-1% 0603 100 mW)
R46  value 0  [RESC0603(1608)_L]  (hidden comment: 0R3J)
R47  value 0  [RESC0603(1608)_L]  (hidden comment: 0R3J)
SW1  431256083716  [4312560837x6]
SW2  431256083716  [4312560837x6]
U3  ESP32-S3-WROOM-1-N16R2  [XCVR_ESP32-S3-WROOM-1-N16R2]

### Blocks framed on the sheet
USB & ESD Protection: D1 J2 R8 R9
Boot & Reset Switches: C5 C29 R7 R26 SW1 SW2
Ethernet W5500 Breakout: J3 R47
Ports: J13-J16

### Ports
3V3_IN (see Main[1C]), DRIVER_EN (see Main[2C], RS485 Receiver[1C]), ETH_MISO (bidir, see Main[1C]), ETH_MOSI (bidir, see Main[1C]), ETH_SCLK (out, see Main[1C]), GND (see Main[1C], MD-XTR-MOSFET[5D], Power[8E], RS485 Receiver[1C]), GPIO (harness COMPUTE_GPIO, see Main[1C]), RECEIVER_EN (see Main[2C], RS485 Receiver[1C]), RX (see Main[2C], RS485 Receiver[1C]), TX (see Main[2C], RS485 Receiver[1C]), USB_5V (see Main[1C], Power[8E])

### Harnesses
COMPUTE_GPIO: GPIO01, GPIO02, GPIO04, GPIO05, GPIO07, GPIO08, GPIO14, GPIO17, GPIO18, GPIO21, GPIO35, GPIO36, GPIO47, GPIO48, GPIO16, GPIO13, GPIO12, GPIO09, GPIO11, GPIO10, GPIO15, GPIO06

### Nets
3V3: C2.2 C3.2 C4.2 J3.10(3V3) J3.11(3V3) R7.2 R26.2 U3.2(3V3) ; port 3V3_IN  [project net 3.3V]
GND: C2.1 C3.1 C4.1 C5.2 C29.2 D1.2(GND) J2.1(MNT_1) J2.2(MNT_2) J2.3(MNT_3) J2.4(MNT_4) J2.A1-B12(GND) J2.B1-A12(GND) J3.1(GND) J3.2(GND) J3.12(GND) J14.1 R8.2 R9.2 SW1.2 SW1.G1(GND) SW1.G2(GND) SW2.2 SW2.G1(GND) SW2.G2(GND) U3.GND ; port GND
USB_5V: D1.5(VBUS) J2.A4-B9(VBUS) J2.B4-A9(VBUS) ; port USB_5V
BOOT: C5.1 R7.1 SW1.1 U3.27(IO0)
CS: J3.5(CS) U3.31(IO38)
EN: C29.1 R26.1 SW2.1 U3.3(EN)
GPIO01: U3.39(IO1) ; port RECEIVER_EN, port GPIO.GPIO01  [project net 20mA_1]
GPIO02: U3.38(IO2) ; port DRIVER_EN, port GPIO.GPIO02  [project net 20mA_2]
GPIO04: U3.4(IO4) ; port GPIO.GPIO04  [project net 20mA_3]
GPIO05: U3.5(IO5) ; port GPIO.GPIO05  [project net 20mA_4]
GPIO06: U3.6(IO6) ; port GPIO.GPIO06  [project net 20mA_5]
GPIO07: U3.7(IO7) ; port GPIO.GPIO07
GPIO08: U3.12(IO8) ; port GPIO.GPIO08
GPIO09: U3.17(IO9) ; port GPIO.GPIO09
GPIO10: U3.18(IO10) ; port GPIO.GPIO10
GPIO11: U3.19(IO11) ; port GPIO.GPIO11
GPIO12: port GPIO.GPIO12
GPIO13: port GPIO.GPIO13
GPIO14: port GPIO.GPIO14
GPIO15: port GPIO.GPIO15
GPIO16: U3.9(IO16) ; port GPIO.GPIO16  [project net CS_N]
GPIO17: port GPIO.GPIO17
GPIO18: port GPIO.GPIO18
GPIO21: port GPIO.GPIO21
GPIO35: port GPIO.GPIO35
GPIO36: port GPIO.GPIO36
GPIO47: port GPIO.GPIO47
GPIO48: port GPIO.GPIO48
INT: J3.6(INT) U3.30(IO37)
MISO: J15.1 R47.2 U3.34(IO41) ; port ETH_MISO
MOSI: J3.3(MOSI) J13.1 R46.1 ; port ETH_MOSI
RST: J3.8(RST) U3.35(IO42)
SBU: J2.A8(SBU1) J2.B8(SBU2)
SCLK: J3.4(SCLK) J16.1 R10.1 ; port ETH_SCLK
USB+: D1.4(IO2) U3.14(IO20)
USB-: D1.6(IO1) U3.13(IO19)
USB_D_N: D1.1(IO1) J2.A7(Dn1) J2.B7(Dn2)
USB_D_P: D1.3(IO2) J2.A6(Dp1) J2.B6(Dp2)
NetCR1_1: U3.36(RXD0) ; port RX
NetCR1_4: U3.37(TXD0) ; port TX
NetJ2_A5: J2.A5(CC1) R8.1
NetJ2_B5: J2.B5(CC2) R9.1
NetJ3_7: J3.7(MISO) R47.1
NetR10_2: R10.2 U3.32(IO39)
NetR46_2: R46.2 U3.33(IO40)

Not connected (* = marked no-connect by the designer): J3 9(NC)*; U3 8(IO15)* 10(IO17)* 11(IO18)* 15(IO3)* 16(IO46)* 20(IO12)* 21(IO13)* 22(IO14)* 23(IO21)* 24(IO47)* 25(IO48)* 26(IO45)* 28(IO35)* 29(IO36)*

### Layout directives
differential pair: USB_D_N, USB_D_P

### Notes on the sheet
- (near U3) IO14 can be used as write protect for FSPI

### Library data of the parts
C2 = CMP-001-00017-6: Chip Capacitor, 100 nF, +/- 10%, 50 V, 0603 (1608 Metric); Voltage Rating: 50V; Capacitor Type: Ceramic; Tolerance: 10%; Mounting Technology: SM; Max Operating Temperature: 125°C; RoHS Compliant: True; Pins: 2; Case/Package: 0603; Min Operating Temperature: -55°C
C3 C5 C29 = CMP-001-00005-6: Chip Capacitor, 1 uF, +/- 10%, 25 V, 0603 (1608 Metric); Capacitor Type: Ceramic; Voltage Rating: 25V; Pins: 2; Mounting Technology: SM; RoHS Compliant: True; Max Operating Temperature: 125°C; Case/Package: 0603; Min Operating Temperature: -55°C; Tolerance: 10%
C4 = CMP-001-00075-4: Chip Capacitor, 10µF +/-20%, 10V, 0603, Thickness 1 mm; Tolerance: 10%; Voltage Rating: 10V; Max Operating Temperature: 85°C; Pins: 2; Case/Package: 0603; Mounting Technology: SMT; Min Operating Temperature: -55°C
D1 = CMP-019-00050-4: Trans Voltage Suppressor Diode, 5V V(RWM), Unidirectional, 1 Element, Silicon; Max Operating Temperature: 125°C; RoHS Compliant: Yes; Min Operating Temperature: -40°C; Pins: 6
J2 = CMP-002-00075-1: Conn USB 2.0 Type C RCP 24 POS 0.3mm/0.5mm Solder RA SMD 24 Terminal 1 Port T/R
J3 = CMP-00030-00004-2: 2.54mm pitch pins footprint for HiLetgo W5500 breakout board (linked).; ComponentLink1Description: https://www.amazon.com/HiLetgo-Ethernet-Network-Interface-WIZ820io/dp/B08KXM8TKJ
J13-J16 = CMP-00011-2: THT TEST POINT, HOOK
R7 R26 = CMP-009-00017-5: Chip Resistor, 10 KOhm, +/- 1%, 01 W, -55 to 155 degC, 0603 (1608 Metric); Voltage Rating: 50V; Power: 100mW; RoHS Compliant: True; Min Operating Temperature: -55°C; Pins: 2; Case/Package: 0603; Mounting Technology: SM; Max Operating Temperature: 155°C; Tolerance: 1%
R8 R9 = CMP-009-00196-2: 5.1 kOhms ±1% 0.1W, 1/10W Chip Resistor 0603 (1608 Metric) Thick Film; Tolerance: 1%; Case/Package: 0603
R10 R46 R47 = CMP-009-00063-2: Jumper 0603 (1608 Metric); Case/Package: 0603; Mounting Technology: SMT; Pins: 2
SW1 SW2 = CMP-00014-1: Button, through-hole, right-angle, long; Manufacturer Series: 431256; Switch Function: SPST; End Contact Material: Stainless Steel; PCB Hole Count: 4; Switch Type: Keypad; Solderability: WAVE; Contact Resistance: 0.1mR; Center Contact Plating: Silver; Insulation Resistance: 100MR; Contact DC Max Rating R Load: 0.05A@12VDC; Body Length or Diameter: 7.3914mm; Actuator Type: Pushbutton; Actuator Length: 0.229inch; Body Height: 6.5532mm; Contact Current(DC)-Max: 50mA; Actuator Material: Polymer; Contact Voltage(DC)-Max: 12V; Actuator Color: Black; Body Breadth: 7.1882mm; Dielectric Withstand Volts: 250VACV; Mounting Technology: Through Hole; Reach SVHC Compliant: Yes; Max Operating Temperature: 85°C; Housing Material: Polymer; Min Operating Temperature: -40°C; Contact Material: Stainless Steel; End Contact Plating: Silver; RoHS Compliant: Yes; Termination: Solder; Terminal Material: Copper Alloy; Terminal Length: 0.138inch
U3 = CMP-118-000000-2: Bluetooth, WiFi 802.11b/g/n, Bluetooth v5.0 Transceiver Module 2.4GHz PCB Trace Surface Mount; MP: ESP32S3WROOM1N16R2; MF: Espressif Systems; SnapEDA_Link: https://www.snapeda.com/parts/ESP32S3WROOM1N16R2/Espressif+Systems/view-part/?ref=snap; Component Type: Standard; Package: NON STANDARD Espressif Systems; Source: ESP32-S3-WROOM-1-N16R2.SchLib; Design Item ID: ESP32-S3-WROOM-1-N16R2; Pin Count: 39; Value: *; Check_prices: https://www.snapeda.com/parts/ESP32S3WROOM1N16R2/Espressif+Systems/view-part/?ref=eda

## Sheet Power.SchDoc
size 431 x 279 mm; SheetNumber: 4; SheetTotal: 7
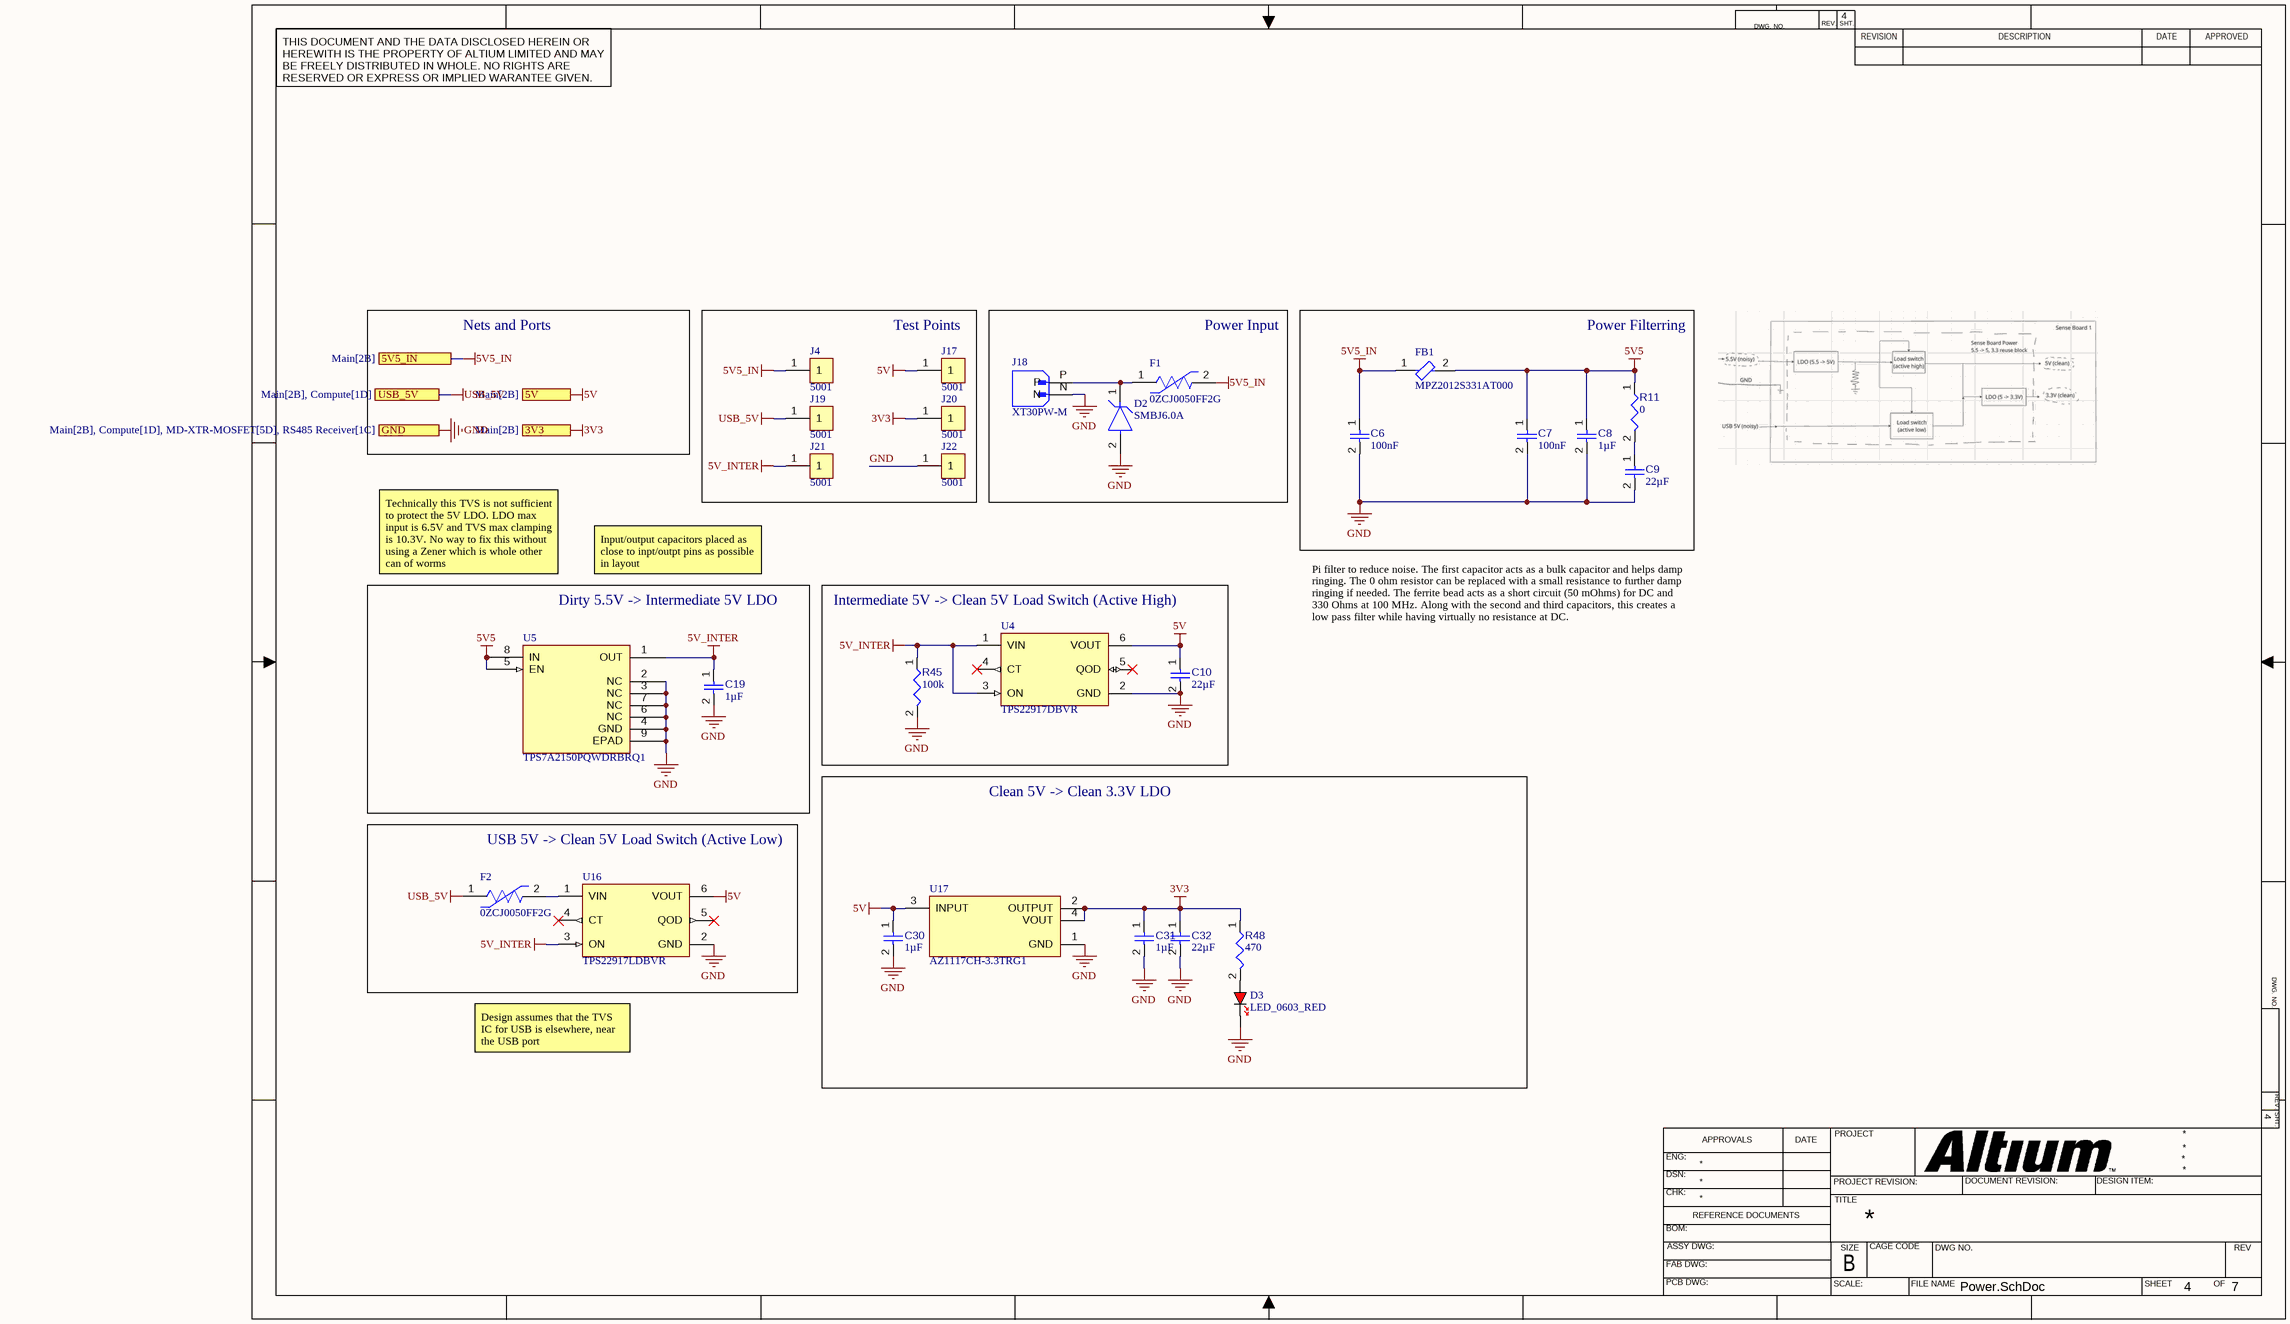
[diagram p6: Power.SchDoc]

### Parts
C6  value 100nF  [CAPC1608X90X40NL10T20]  (hidden comment: Capacitor 100 nF +/-10% 50 V 0603)
C7  value 100nF  [CAPC1608X90X40NL10T20]  (hidden comment: Capacitor 100 nF +/-10% 50 V 0603)
C8  value 1µF  [CAPC1608X94X35NL15T15]  (hidden comment: Capacitor 1 uF +/- 10% 16 V 0603)
C9  value 22µF  [CAPC0805(2012)145_L]  (hidden comment: Capacitor 22µF +/-40% 16V 0805)
C10  value 22µF  [CAPC0805(2012)145_L]  (hidden comment: Capacitor 22µF +/-40% 16V 0805)
C19  value 1µF  [CAPC0603(1608)100_L]  (hidden comment: Capacitor 1µF +/-40% 50V 0603)
C30  value 1µF  [CAPC0603(1608)100_L]  (hidden comment: Capacitor 1µF +/-40% 50V 0603)
C31  value 1µF  [CAPC0603(1608)100_L]  (hidden comment: Capacitor 1µF +/-40% 50V 0603)
C32  value 22µF  [CAPC0805(2012)145_L]  (hidden comment: Capacitor 22µF +/-40% 16V 0805)
D2  SMBJ6.0A  [FP-SMBJ-MFG]
D3  LED_0603_RED  [LED_0603_RED]
F1  0ZCJ0050FF2G  [FP-0ZCJ0050FF2G-MFG]
F2  0ZCJ0050FF2G  [FP-0ZCJ0050FF2G-MFG]
FB1  MPZ2012S331AT000  [FP-MPZ2012-IPC_A]
J4  5001  [FP-5001-MFG]
J17  5001  [FP-5001-MFG]
J18  XT30PW-M  [AMASS_XT30PW-M]
J19  5001  [FP-5001-MFG]
J20  5001  [FP-5001-MFG]
J21  5001  [FP-5001-MFG]
J22  5001  [FP-5001-MFG]
R11  value 0  [RESC0603(1608)_L]  (hidden comment: 0R3J)
R45  value 100k  [RESC1608X55X25NL10T15]  (hidden comment: Resistor 100k +/-1% 0603 100 mW)
R48  value 470  [RESC1608X55X25NL10T15]  (hidden comment: Resistor 470R +/-1% 0603 100 mW)
U4  TPS22917DBVR  [FP-DBV0006A-IPC_A]
U5  TPS7A2150PQWDRBRQ1  [SON65P300X100_HS-9N]
U16  TPS22917LDBVR  [FP-DBV0006A-IPC_B]
U17  AZ1117CH-3.3TRG1  [FP-SOT223-IPC_B]

### Blocks framed on the sheet
Test Points: J4 J17 J19-J22
Power Input: D2 F1 J18
Power Filterring: C6-C9 FB1 R11
Dirty 5.5V -> Intermediate 5V LDO: C19 U5
Intermediate 5V -> Clean 5V Load Switch (Active High): C10 R45 U4
Clean 5V -> Clean 3.3V LDO: C30-C32 D3 R48 U17
USB 5V -> Clean 5V Load Switch (Active Low): F2 U16

### Ports
3V3 (see Main[2B]), 5V5_IN (see Main[2B]), 5V (see Main[2B]), GND (see Main[2B], Compute[1D], MD-XTR-MOSFET[5D], RS485 Receiver[1C]), USB_5V (see Main[2B], Compute[1D])

### Nets
3V3: C31.1 C32.1 J20.1 R48.1 U17.2(OUTPUT) U17.4(VOUT) ; port 3V3  [project net 3.3V]
5V: C10.1 C30.1 J17.1 U4.6(VOUT) U16.6(VOUT) U17.3(INPUT) ; port 5V
5V5: C7.1 C8.1 FB1.2 R11.1 U5.5(EN) U5.8(IN)
5V5_IN: C6.1 F1.2 FB1.1 J4.1 ; port 5V5_IN
5V_INTER: C19.1 J21.1 R45.1 U4.1(VIN) U4.3(ON) U5.1(OUT) U16.3(ON)
GND: C6.2 C7.2 C8.2 C9.2 C10.2 C19.2 C30.2 C31.2 C32.2 D2.2(A) D3.K J18.N J22.1 R45.2 U4.2(GND) U5.2(NC) U5.3(NC) U5.4(GND) U5.6(NC) U5.7(NC) U5.9(EPAD) U16.2(GND) U17.1(GND) ; port GND
USB_5V: F2.1 J19.1 ; port USB_5V
NetC9_1: C9.1 R11.2
NetD2_1: D2.1(C) F1.1 J18.P
NetD3_A: D3.A R48.2
NetF2_2: F2.2 U16.1(VIN)

Not connected (* = marked no-connect by the designer): U4 4(CT)* 5(QOD)*; U16 4(CT)* 5(QOD)*

### Notes on the sheet
- Nets and Ports
- Technically this TVS is not sufficient to protect the 5V LDO. LDO max input is 6.5V and TVS max clamping is 10.3V. No way to fix this without using a Zener which is whole other can of worms
- Input/output capacitors placed as close to inpt/outpt pins as possible in layout
- Pi filter to reduce noise. The first capacitor acts as a bulk capacitor and helps damp ringing. The 0 ohm resistor can be replaced with a small resistance to further damp ringing if needed. The ferrite bead acts as a short circuit (50 mOhms) for DC and 330 Ohms at 100 MHz. Along with the second and third capacitors, this creates a low pass filter while having virtually no resistance at DC.
- Design assumes that the TVS IC for USB is elsewhere, near the USB port
- DWG. NO.
- REV.
- SHT.
- THIS DOCUMENT AND THE DATA DISCLOSED HEREIN OR HEREWITH IS THE PROPERTY OF ALTIUM LIMITED AND MAY BE FREELY DISTRIBUTED IN WHOLE. NO RIGHTS ARE RESERVED OR EXPRESS OR IMPLIED WARANTEE GIVEN.
- REVISION
- DESCRIPTION
- DATE
- APPROVED
- ENG:
- APPROVALS
- PROJECT
- DSN:
- CHK:
- REFERENCE DOCUMENTS
- PROJECT REVISION:
- TITLE
- DOCUMENT REVISION:
- DESIGN ITEM:
- BOM:
- FAB DWG:
- PCB DWG:
- ASSY DWG:
- SCALE:
- SIZE
- B
- CAGE CODE
- FILE NAME
- DWG NO.
- SHEET
- OF
- REV

### Library data of the parts
C6 C7 = CMP-001-00017-6: as C2 on sheet Compute; Tolerance: 10%; Mounting Technology: SM; Max Operating Temperature: 125°C; RoHS Compliant: True; Pins: 2; Case/Package: 0603; Min Operating Temperature: -55°C
C8 = CMP-001-00003-6: Chip Capacitor, 1 uF, +/- 10%, 16 V, 0603 (1608 Metric); Voltage Rating: 16V; Capacitor Type: Ceramic; Max Operating Temperature: 125°C; Pins: 2; Tolerance: 10%; Min Operating Temperature: -55°C; RoHS Compliant: True; Mounting Technology: SM; Case/Package: 0603
C9 C10 C32 = CMP-001-00081-4: Chip Capacitor, 22µF +/-40%, 16V, 0805, Thickness 1.45 mm; Tolerance: 5%; Voltage Rating: 16V; Mounting Technology: SMT; Pins: 2; Max Operating Temperature: 85°C; Case/Package: 0805; Min Operating Temperature: -55°C
C19 C30 C31 = CMP-001-00078-4: Chip Capacitor, 1µF +/-40%, 50V, 0603, Thickness 1 mm; Tolerance: 10%; Case/Package: 0603; Pins: 2; Max Operating Temperature: 85°C; Voltage Rating: 50V; Mounting Technology: SMT; Min Operating Temperature: -55°C
D2 = CMP-00013-1: TVS Diode, 6V Standoff, 600W, 60V V(RWM), Unidirectional, 1 Element, Silicon, DO-214AA; Min Breakdown Voltage: 66.7V; Diode Type: TRANS VOLTAGE SUPPRESSOR; Number of Elements: 1; Max Breakdown Voltage: 10.3V; Reverse Standoff Voltage: 6.0V; Max Operating Temperature: 150°C; Polarity: Unidirectional; Diode Element Material: SILICON; JESD-30 Code: R-PDSO-C2; JESD-609 Code: e3; Rep Pk Reverse Voltage-Max: 60V; Mounting Technology: SMT; Non-rep Peak Rev Power Dis-Max: 600W; JEDEC-95 Code: DO-214AA; RoHS Compliant: Yes; Moisture Sensitivity Level: 1; Min Operating Temperature: -65°C; Pins: 2; Case/Package: DO-214AA; Peak Reflow Temperature (Cel): 260°C
D3 = CMP-004-00058-1: LED 0603 RED SMD; Source: Schematic-Lib-PhilsLab.SchLib; Design Item ID: LED_0603_RED
F1 F2 = CMP-00012-1: PTC Resettable Fuse, 8V, 0.5A hold, 1A trip, 0.15ohm, Surface Mount; Package Width: 1.8mm; Package Length: 3.5mm; Current Rating: 100A; Package Height: 0.55mm; Reference Standard: UL; Resistor Type: PTC THERMISTOR; Terminal Finish: Tin; Min Operating Temperature: -40°C; Working Voltage: 8V; Case/Package: 1206; RoHS Compliant: Yes; Mounting Technology: SMT; Reach SVHC Compliant: Yes; Pins: 2; Max Operating Temperature: 85°C; JESD-609 Code: e3
FB1 = CMP-00024-1: Ferrite Beads, 330Ohm 25% 100MHz, 50 mOhm DC, 2.5A, 0805; DC Resistance (DCR): 50mΩ; Impedance: 330Ω; Value: 50mΩ; Min Width: 1.05mm; Max Operating Temperature: 125°C; Clock Frequency: 100MHz; Pins: 2; Case/Package: 0805; Mounting Technology: Surface Mount; Max DC Current: 2.5A; ESR: 50mΩ; RMS Current (Irms): 2.5A; Current Rating: 2.5A; Min Operating Temperature: -55°C; Tolerance: 25%; Termination: SMD/SMT; Core Material: Ferrite; RoHS: Compliant; Test Frequency: 100MHz
J4 J17 J19-J22 = CMP-2000-05181-2: PC TEST POINT MINIATURE BLACK; Body Material: Bronze; Plating: Silver; Inside Diameter: 1.27mm; Hole Diameter: 1.6mm; Number of Ports: 1; Outside Diameter: 2.54mm; Insulation: Insulated; Insulation Material: Nylon; Mount: Through Hole; RoHS Compliant: Yes; Series: THM; Height: 0.3inch; Termination: Through Hole; Material: Nylon; Packaging: Bulk; Contact Material: Bronze; REACH SVHC: No SVHC; Contact Plating: Silver; Orientation: Straight; Lead Free: Lead Free; Package Quantity: 100; Length: 7.62mm; Flammability Rating: UL94 V-0; Number of Contacts: 1; Diameter: 2.54mm; Housing Color: Black; Color: Black
J18 = CMP-002-00206-1: Socket; DC supply; XT30; male; PIN: 2; on PCBs; THT; Colour: yellow; MF: AMASS; Case/Package: None; MP: XT30PW-M; Value: *; Pins: 2; Design Item ID: XT30PW-M; Component Type: Standard; Source: XT30PW-M.SchLib; SnapEDA_Link: https://www.snapeda.com/parts/XT30PW-M/AMASS/view-part/?ref=snap; Check_prices: https://www.snapeda.com/parts/XT30PW-M/AMASS/view-part/?ref=eda
R11 = CMP-009-00063-2: Jumper 0603 (1608 Metric); Case/Package: 0603; Mounting Technology: SMT; Pins: 2
R45 = CMP-009-00023-5: Chip Resistor, 100 KOhm, +/- 1%, 0.1 W, -55 to 155 degC, 0603 (1608 Metric); Voltage Rating: 50V; Power: 100mW; Max Operating Temperature: 155°C; RoHS Compliant: True; Tolerance: 1%; Pins: 2; Case/Package: 0603; Mounting Technology: SM; Min Operating Temperature: -55°C
R48 = CMP-009-00297-1: Chip Resistor, 470 Ohm, +/-1%, 0.1 W, -55 to 155 degC, 0603 (1608 Metric); Voltage Rating: 50V; Power: 100mW; Tolerance: 1%; Case/Package: 0603; Mounting Technology: SM; RoHS Compliant: True; Max Operating Temperature: 155°C; Min Operating Temperature: -55°C; Pins: 2
U4 = CMP-04912-000029-1: IC PWR SWITCH P-CHAN 1:1 SOT23-6; Number of Outputs: 1; Output Configuration: High Side; Fault Protection: Reverse Current; Interface: On/Off; Max Output Current: 2A; Max Operating Temperature: 125°C; Case/Package: SOT-23-6; Packaging: Tape and Reel; Number of Channels: 1; Min Operating Temperature: -40°C
U5 = CMP-019-00074-10: Automotive, 500mA, low-noise ultra-low-IQ high-PSRR low-dropout (LDO) voltage regulator 8-SON -40 to 125
U16 = CMP-019-00081-3: 5.5-V, 2-A, 80-mΩ , 10-nA leakage load switch adj. rise time and adj output discharge 6-SOT-23 -45 to 125, EN Active Low; RoHS Compliant: Yes
U17 = CMP-00015-1: IC LDO, 3.3V FIXED OUTPUT, 1.3V MAX DROPOUT, 1A; Output Current1-Max: 800mA; Dropout Voltage1-Nom: 1.2V; Output Voltage1-Max: 3.365V; Regulator Type: FIXED POSITIVE SINGLE OUTPUT LDO REGULATOR; Voltage Tolerance-Max: 1.97%; Number of Outputs: 1; Package Body Material: Plastic; Qualification Status: Not Qualified; Output Voltage1-Min: 3.235V; Max Supply Voltage: 15V; Input Voltage Absolute-Max: 18V; Dropout Voltage1-Max: 1.3V; JESD-30 Code: R-PDSO-G3; Technology: BIPOLAR; Operating Temperature, TJ-Min: -20°C; Pins: 3; Adjustability: FIXED; Height - Seated (Max): 1.8mm; Length: 6.5mm; Moisture Sensitivity Level: 1; Terminal Position: DUAL; Channels: 1; Width: 3.5mm; Packaging: Tape and Reel; Output Voltage1-Nom: 3.3V; Reach SVHC Compliant: Yes; Terminal Form: Gull Wing; Operating Temperature, TJ-Max: 125°C; RoHS Compliant: Yes; Terminal Pitch: 2.3mm; Terminal Finish: Tin; Surface Mount: Yes; JESD-609 Code: e3; Case/Package: SOP; Package Shape: Rectangular

## Nets that join several sheets
3.3V: RS485 Receiver (C1.1 CR1.8 R17.2), MD-DAC (C18.1 U13.16), Compute (8 pins), Power (6 pins)
24V: Designator (U14E.1), Designator (U14D.1), Designator (U14C.1), Designator (U14B.1), Designator (U14A.1)
+5: Designator (C21E.1 R36E.1 U14E.5 U15E.1), Designator (C21D.1 R36D.1 U14D.5 U15D.1), Designator (C21C.1 R36C.1 U14C.5 U15C.1), Designator (C21B.1 R36B.1 U14B.5 U15B.1), Designator (C21A.1 R36A.1 U14A.5 U15A.1)
GND: RS485 Receiver (12 pins), MD-DAC (6 pins), Designator (10 pins), MD-ADC Feedback (15 pins), Designator (10 pins), Designator (10 pins), Designator (10 pins), Designator (10 pins), Compute (25 pins), Power (23 pins)
USB_5V: Compute (D1.5 J2.A4-B9 J2.B4-A9), Power (F2.1 J19.1)
20mA_1: RS485 Receiver (CR1.2), MD-ADC Feedback (C24.2 D4.2 R40.2), Designator (6 pins), Compute (U3.39)
20mA_2: RS485 Receiver (CR1.3), MD-ADC Feedback (C27.2 D7.2 R43.2), Designator (6 pins), Compute (U3.38)
20mA_3: MD-ADC Feedback (C28.2 D8.2 R44.2), Designator (6 pins), Compute (U3.4)
20mA_4: MD-ADC Feedback (C25.2 D5.2 R41.2), Designator (6 pins), Compute (U3.5)
20mA_5: Designator (6 pins), MD-ADC Feedback (C26.2 D6.2 R42.2), Compute (U3.6)
CS_N: MD-DAC (U13.12), Compute (U3.9)
DAC_CH1: MD-DAC (C13.2), Designator (U14D.6)
DAC_CH2: MD-DAC (C14.2), Designator (U14C.6)
DAC_CH3: MD-DAC (C15.2), Designator (U14B.6)
DAC_CH4: MD-DAC (C16.2), Designator (U14A.6)
DAC_CH5: MD-DAC (C17.2), Designator (U14E.6)
GPIO07: Designator (R33D.2), Compute (U3.7)
GPIO08: Designator (R33C.2), Compute (U3.12)
GPIO09: Designator (R33B.2), Compute (U3.17)
GPIO10: Designator (R33A.2), Compute (U3.18)
GPIO11: Designator (R33E.2), Compute (U3.19)
MISO: MD-DAC (U13.15), Compute (J15.1 R47.2 U3.34)
MOSI: MD-DAC (U13.14), Compute (J3.3 J13.1 R46.1)
NetCR1_1: RS485 Receiver (CR1.1), Compute (U3.36)
NetCR1_4: RS485 Receiver (CR1.4), Compute (U3.37)
SCLK: MD-DAC (U13.13), Compute (J3.4 J16.1 R10.1)